# EasyEDA Pro project honglin-first_crt_smartphone-e4cb491d.epro, schematic CRT手机

## Sheets
1 SD、CPU、WIFI
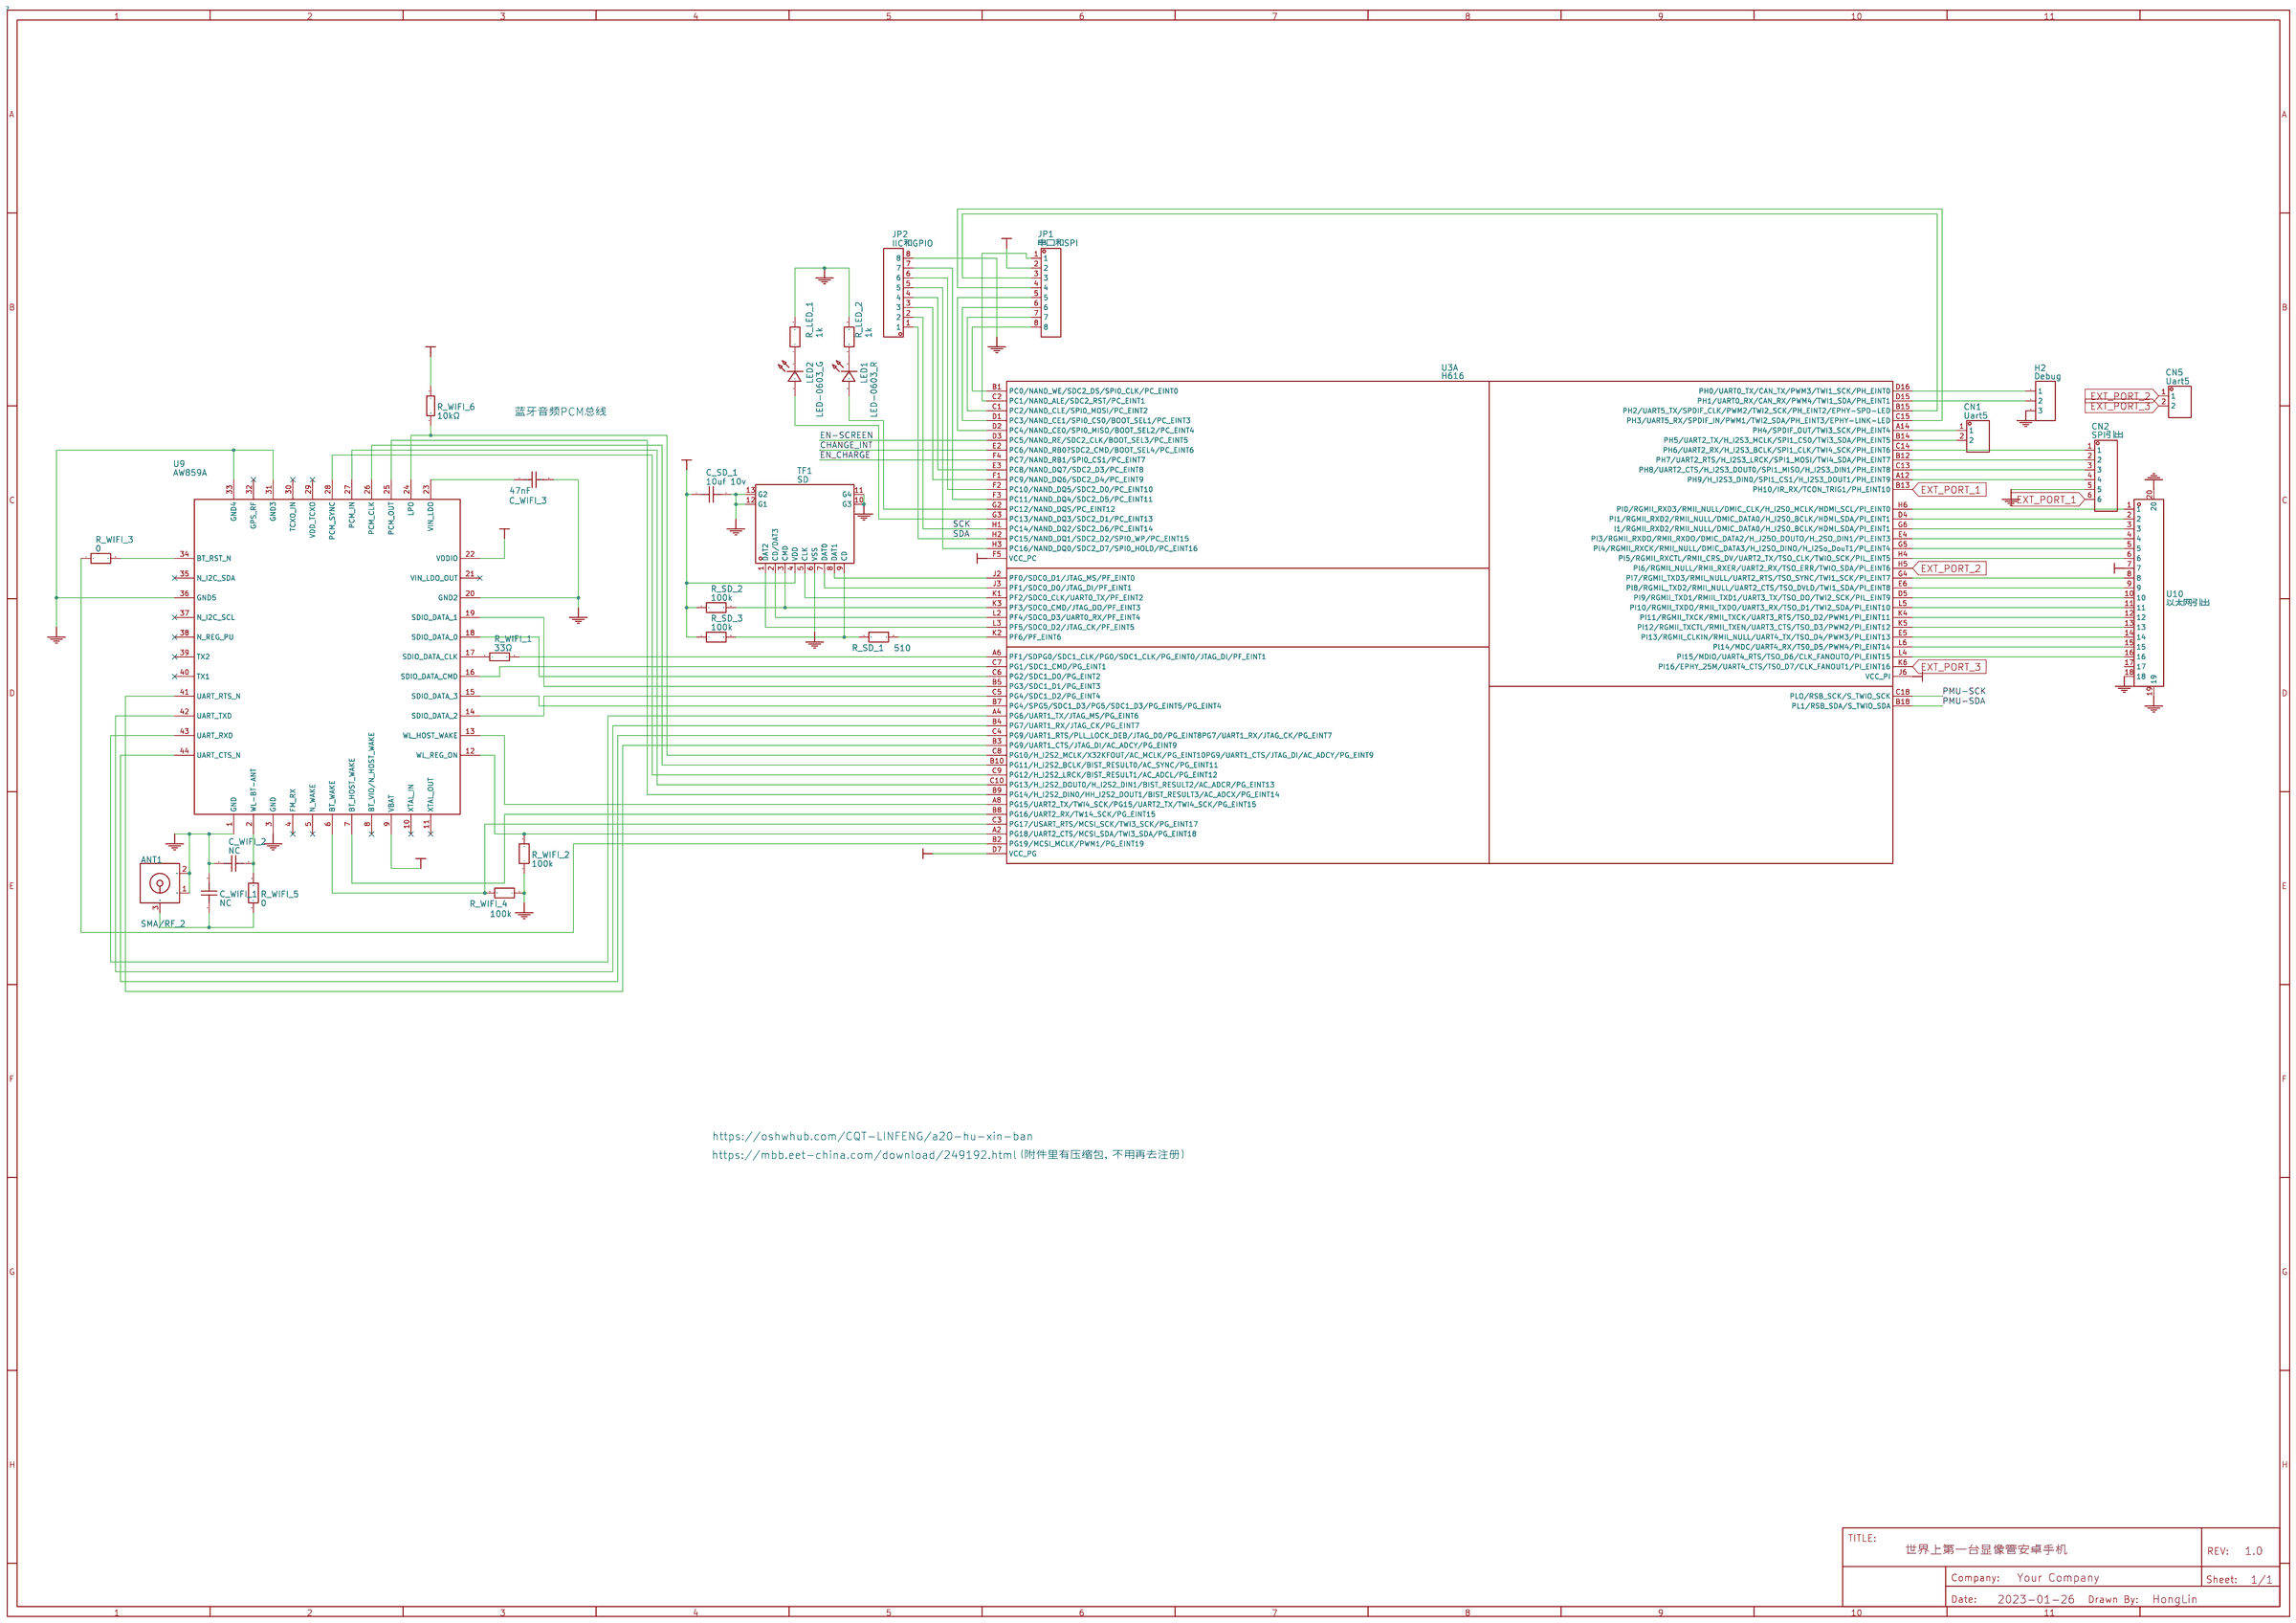
[diagram p0: SD、CPU、WIFI]
2 SCH-ATmega32a-IQK40A
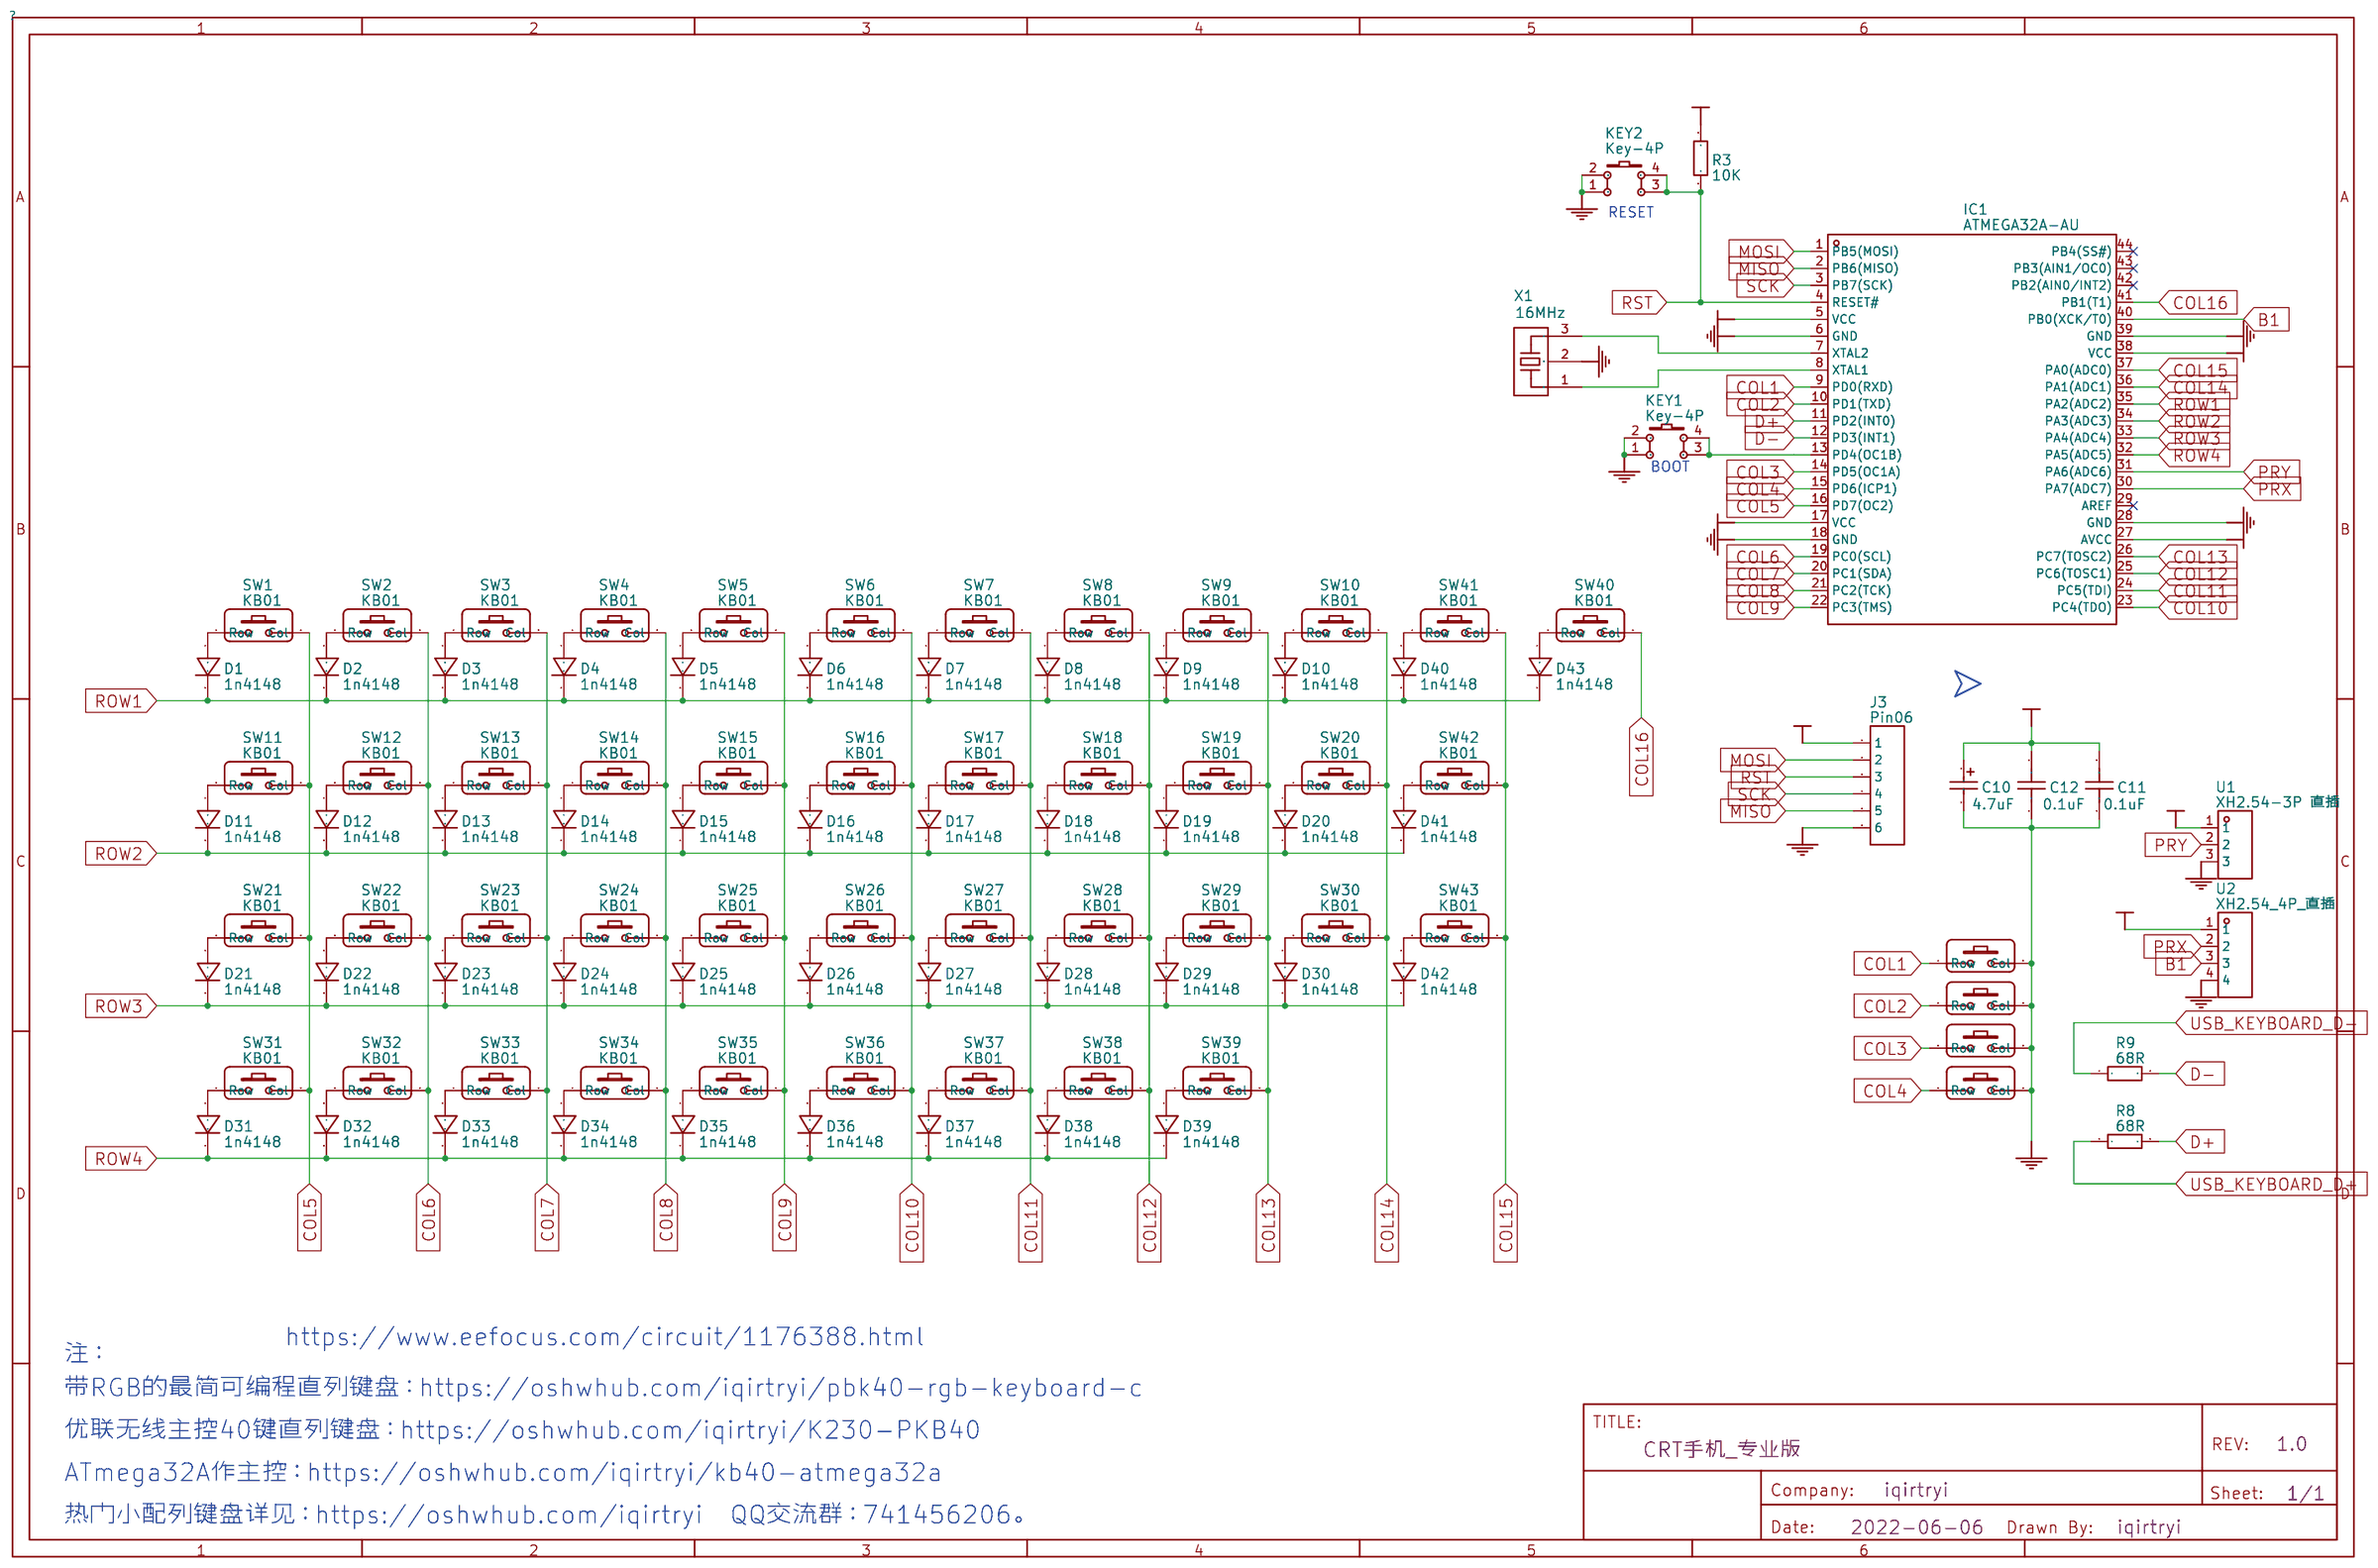
[diagram p1: SCH-ATmega32a-IQK40A]
3 电源管理
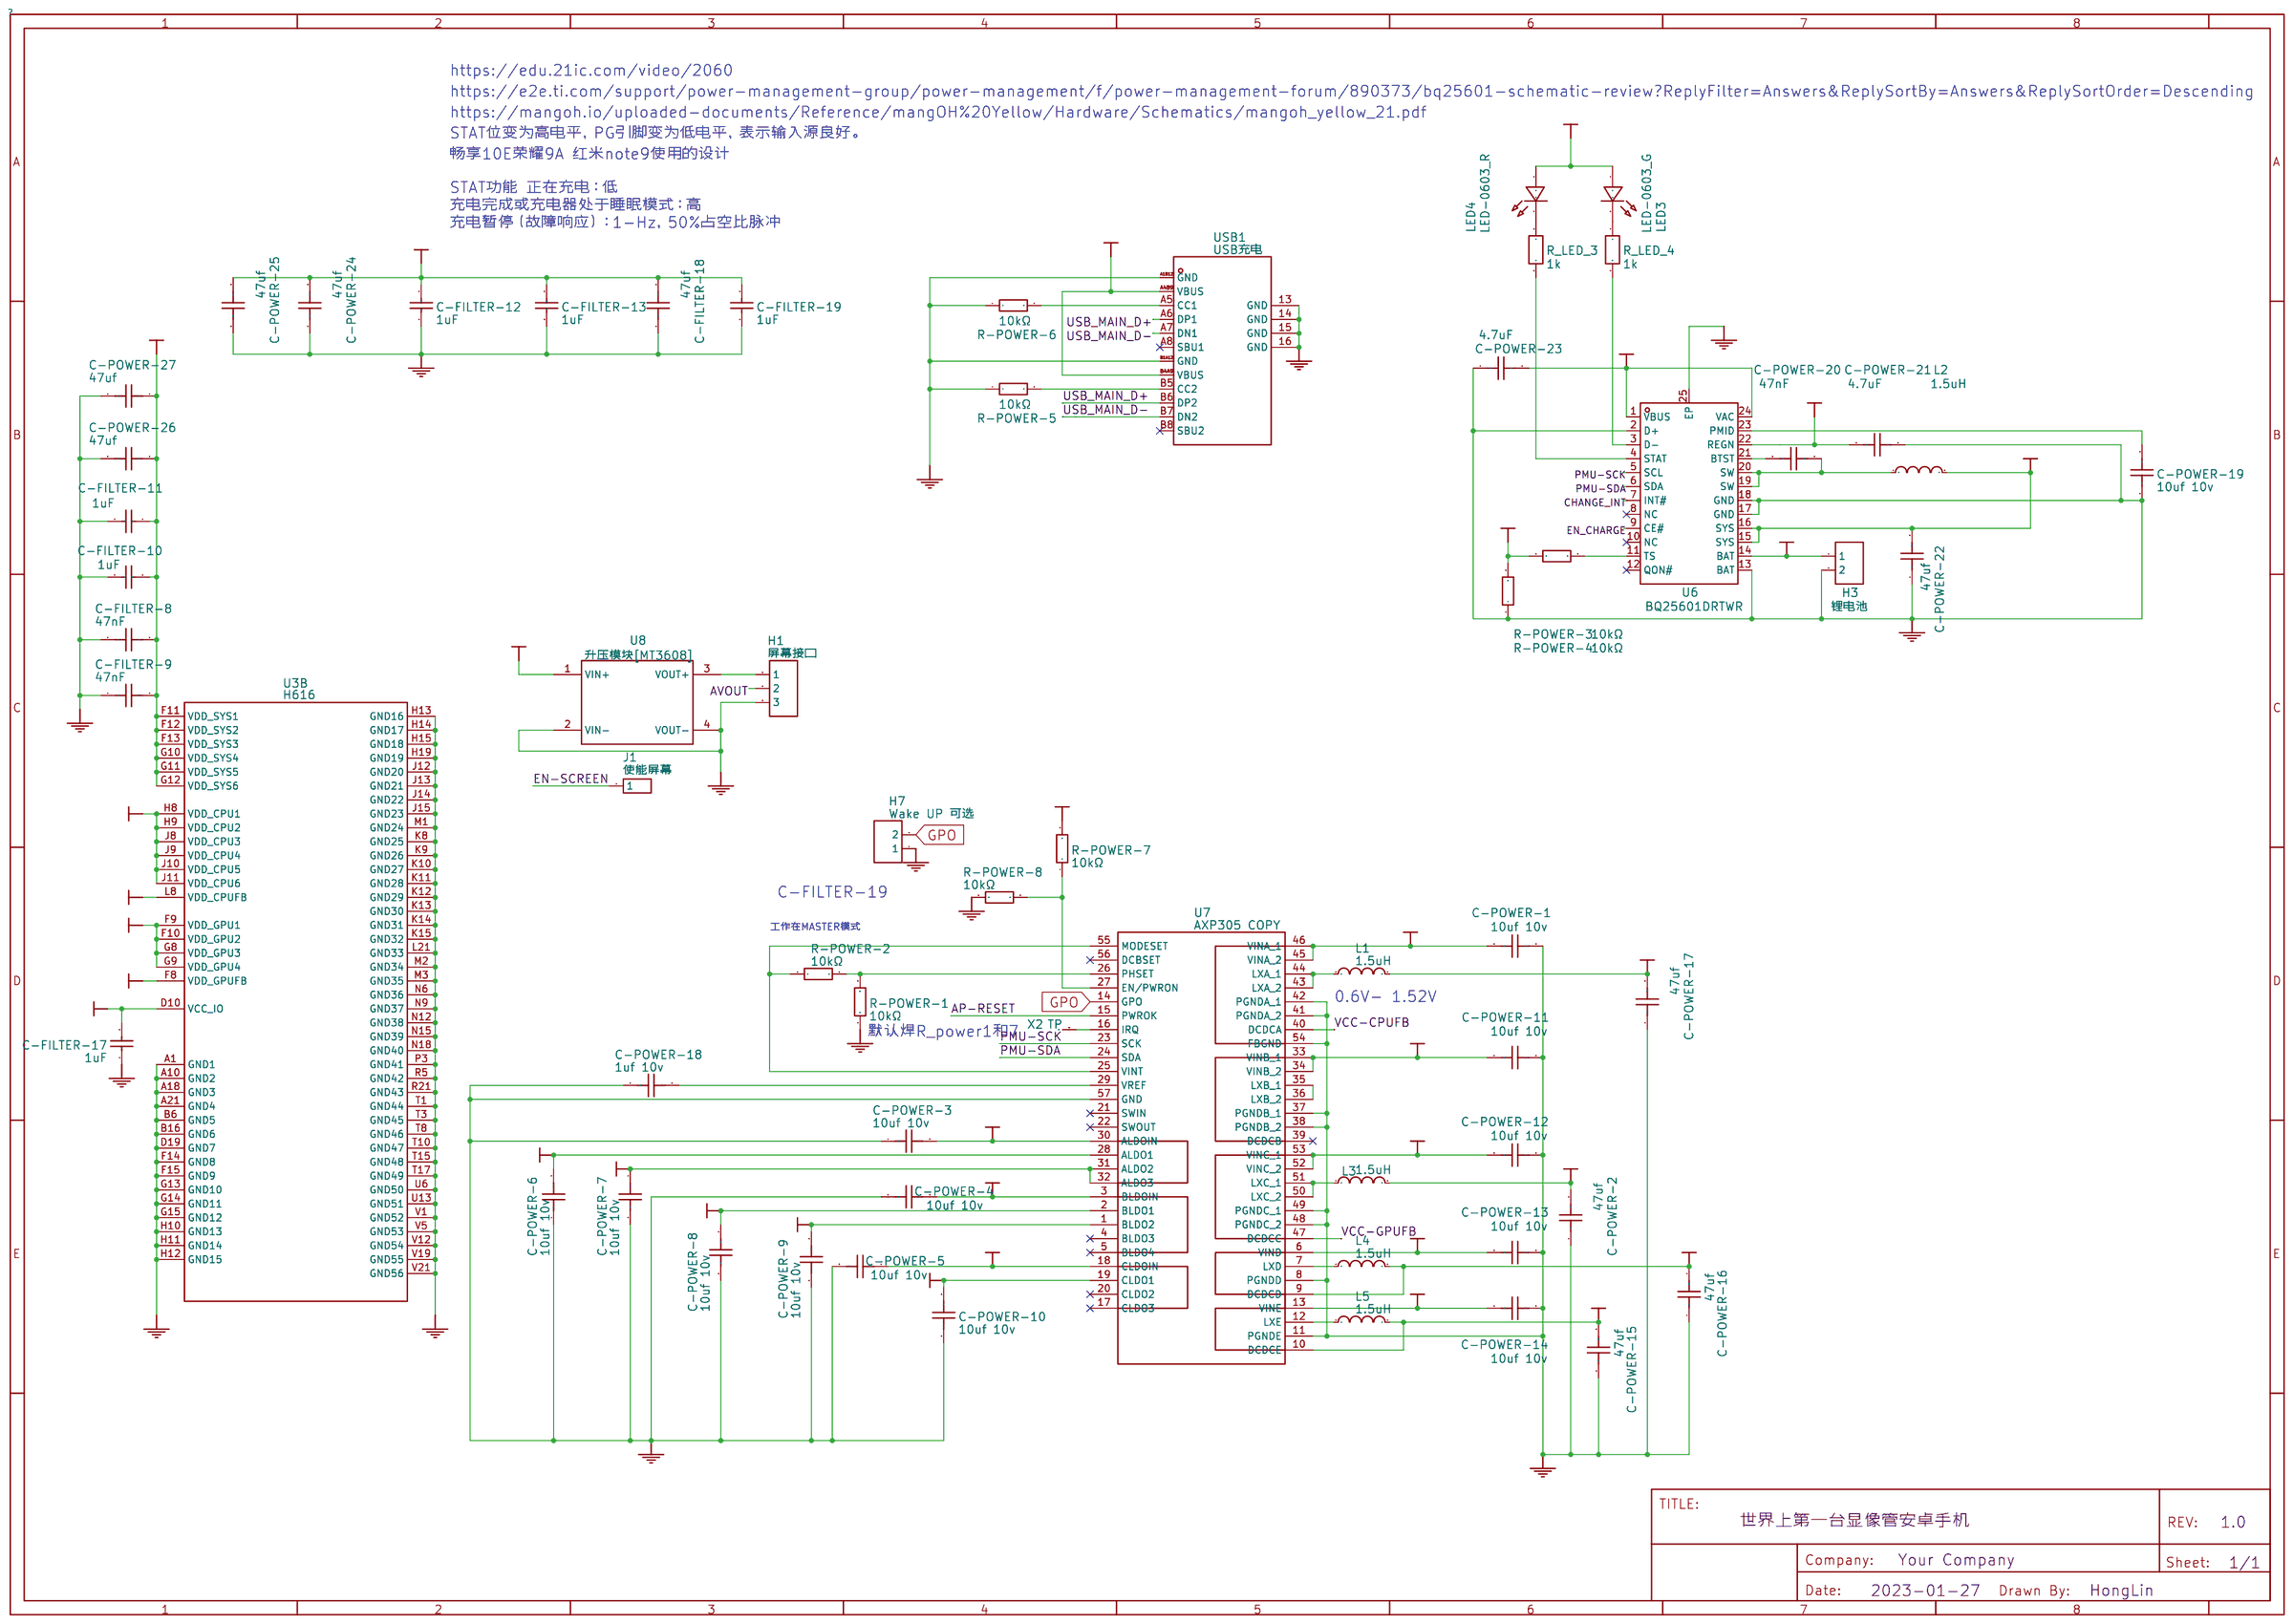
[diagram p2: 电源管理]
4 内存
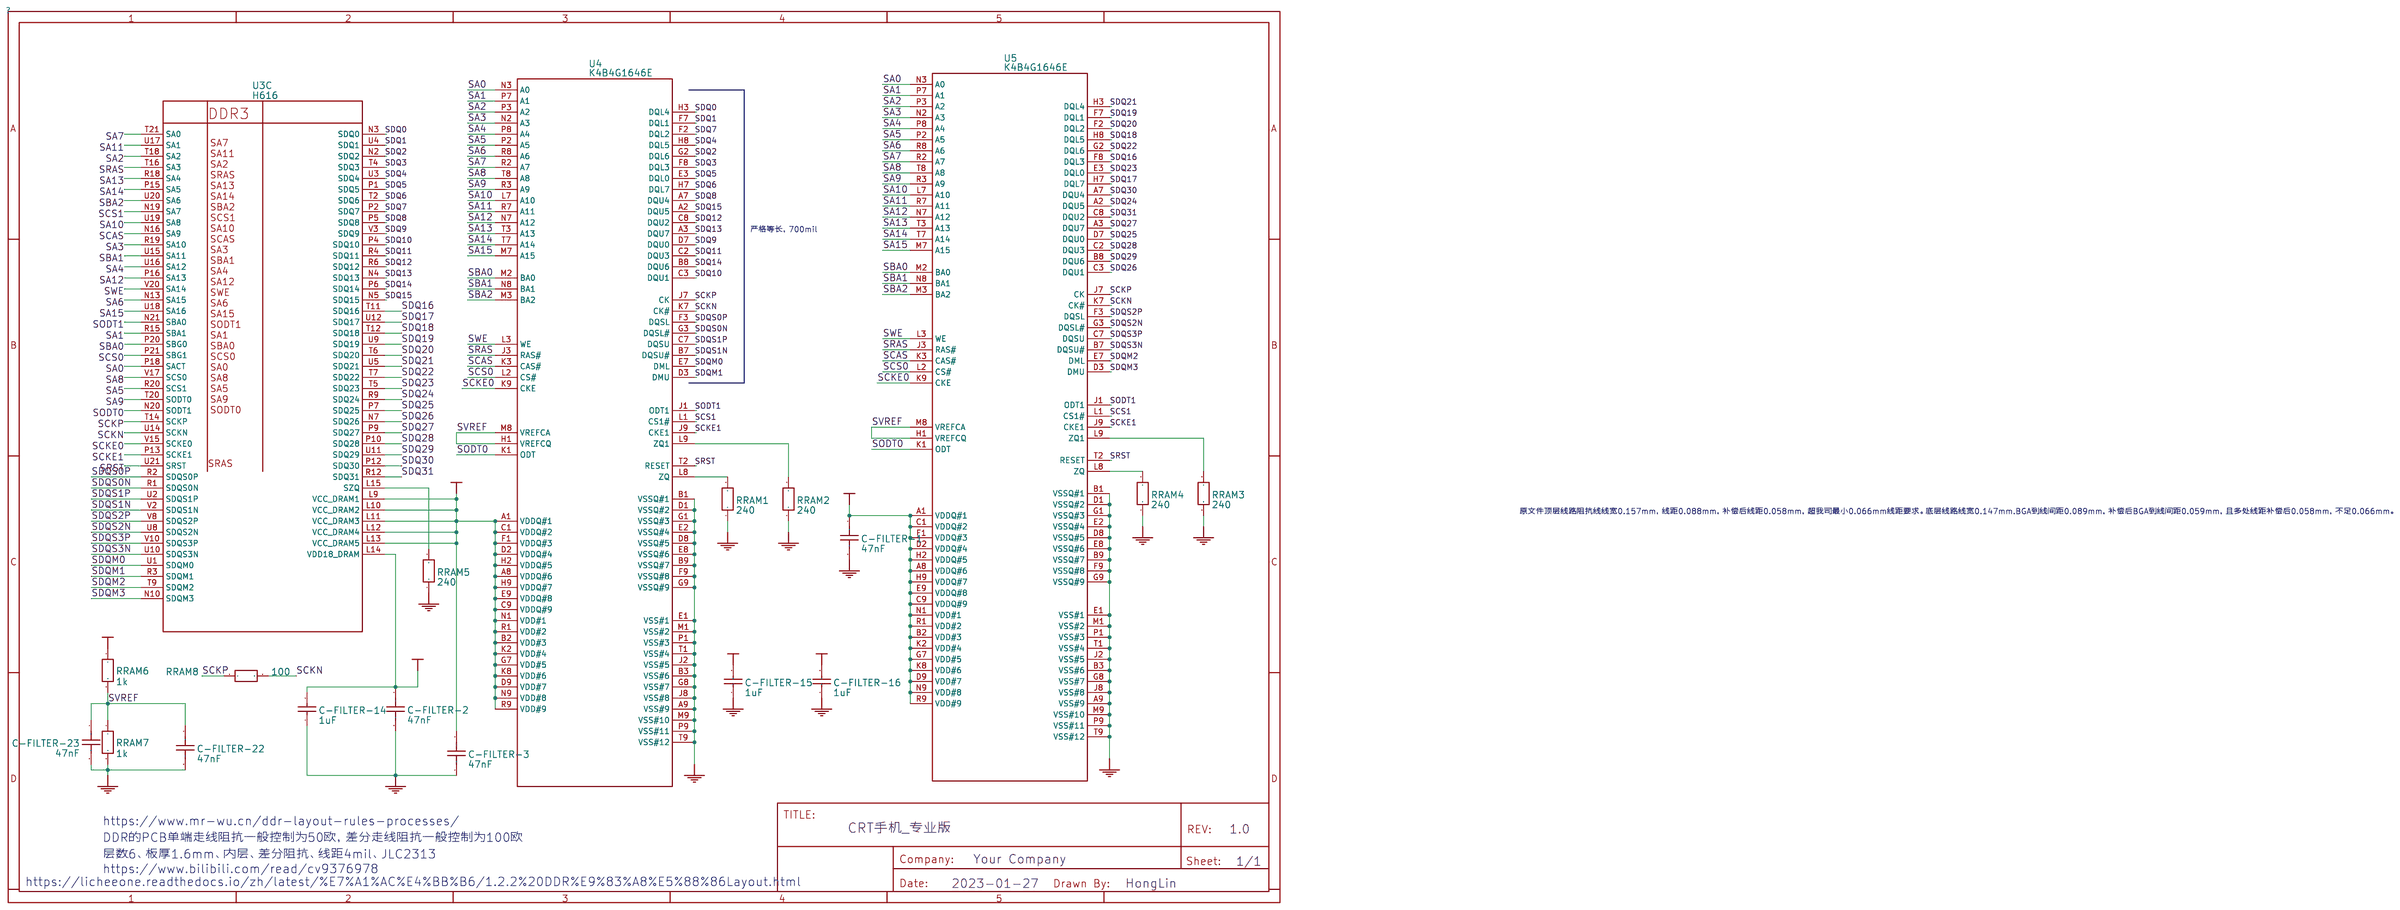
[diagram p3: 内存]
5 HDMI、USB
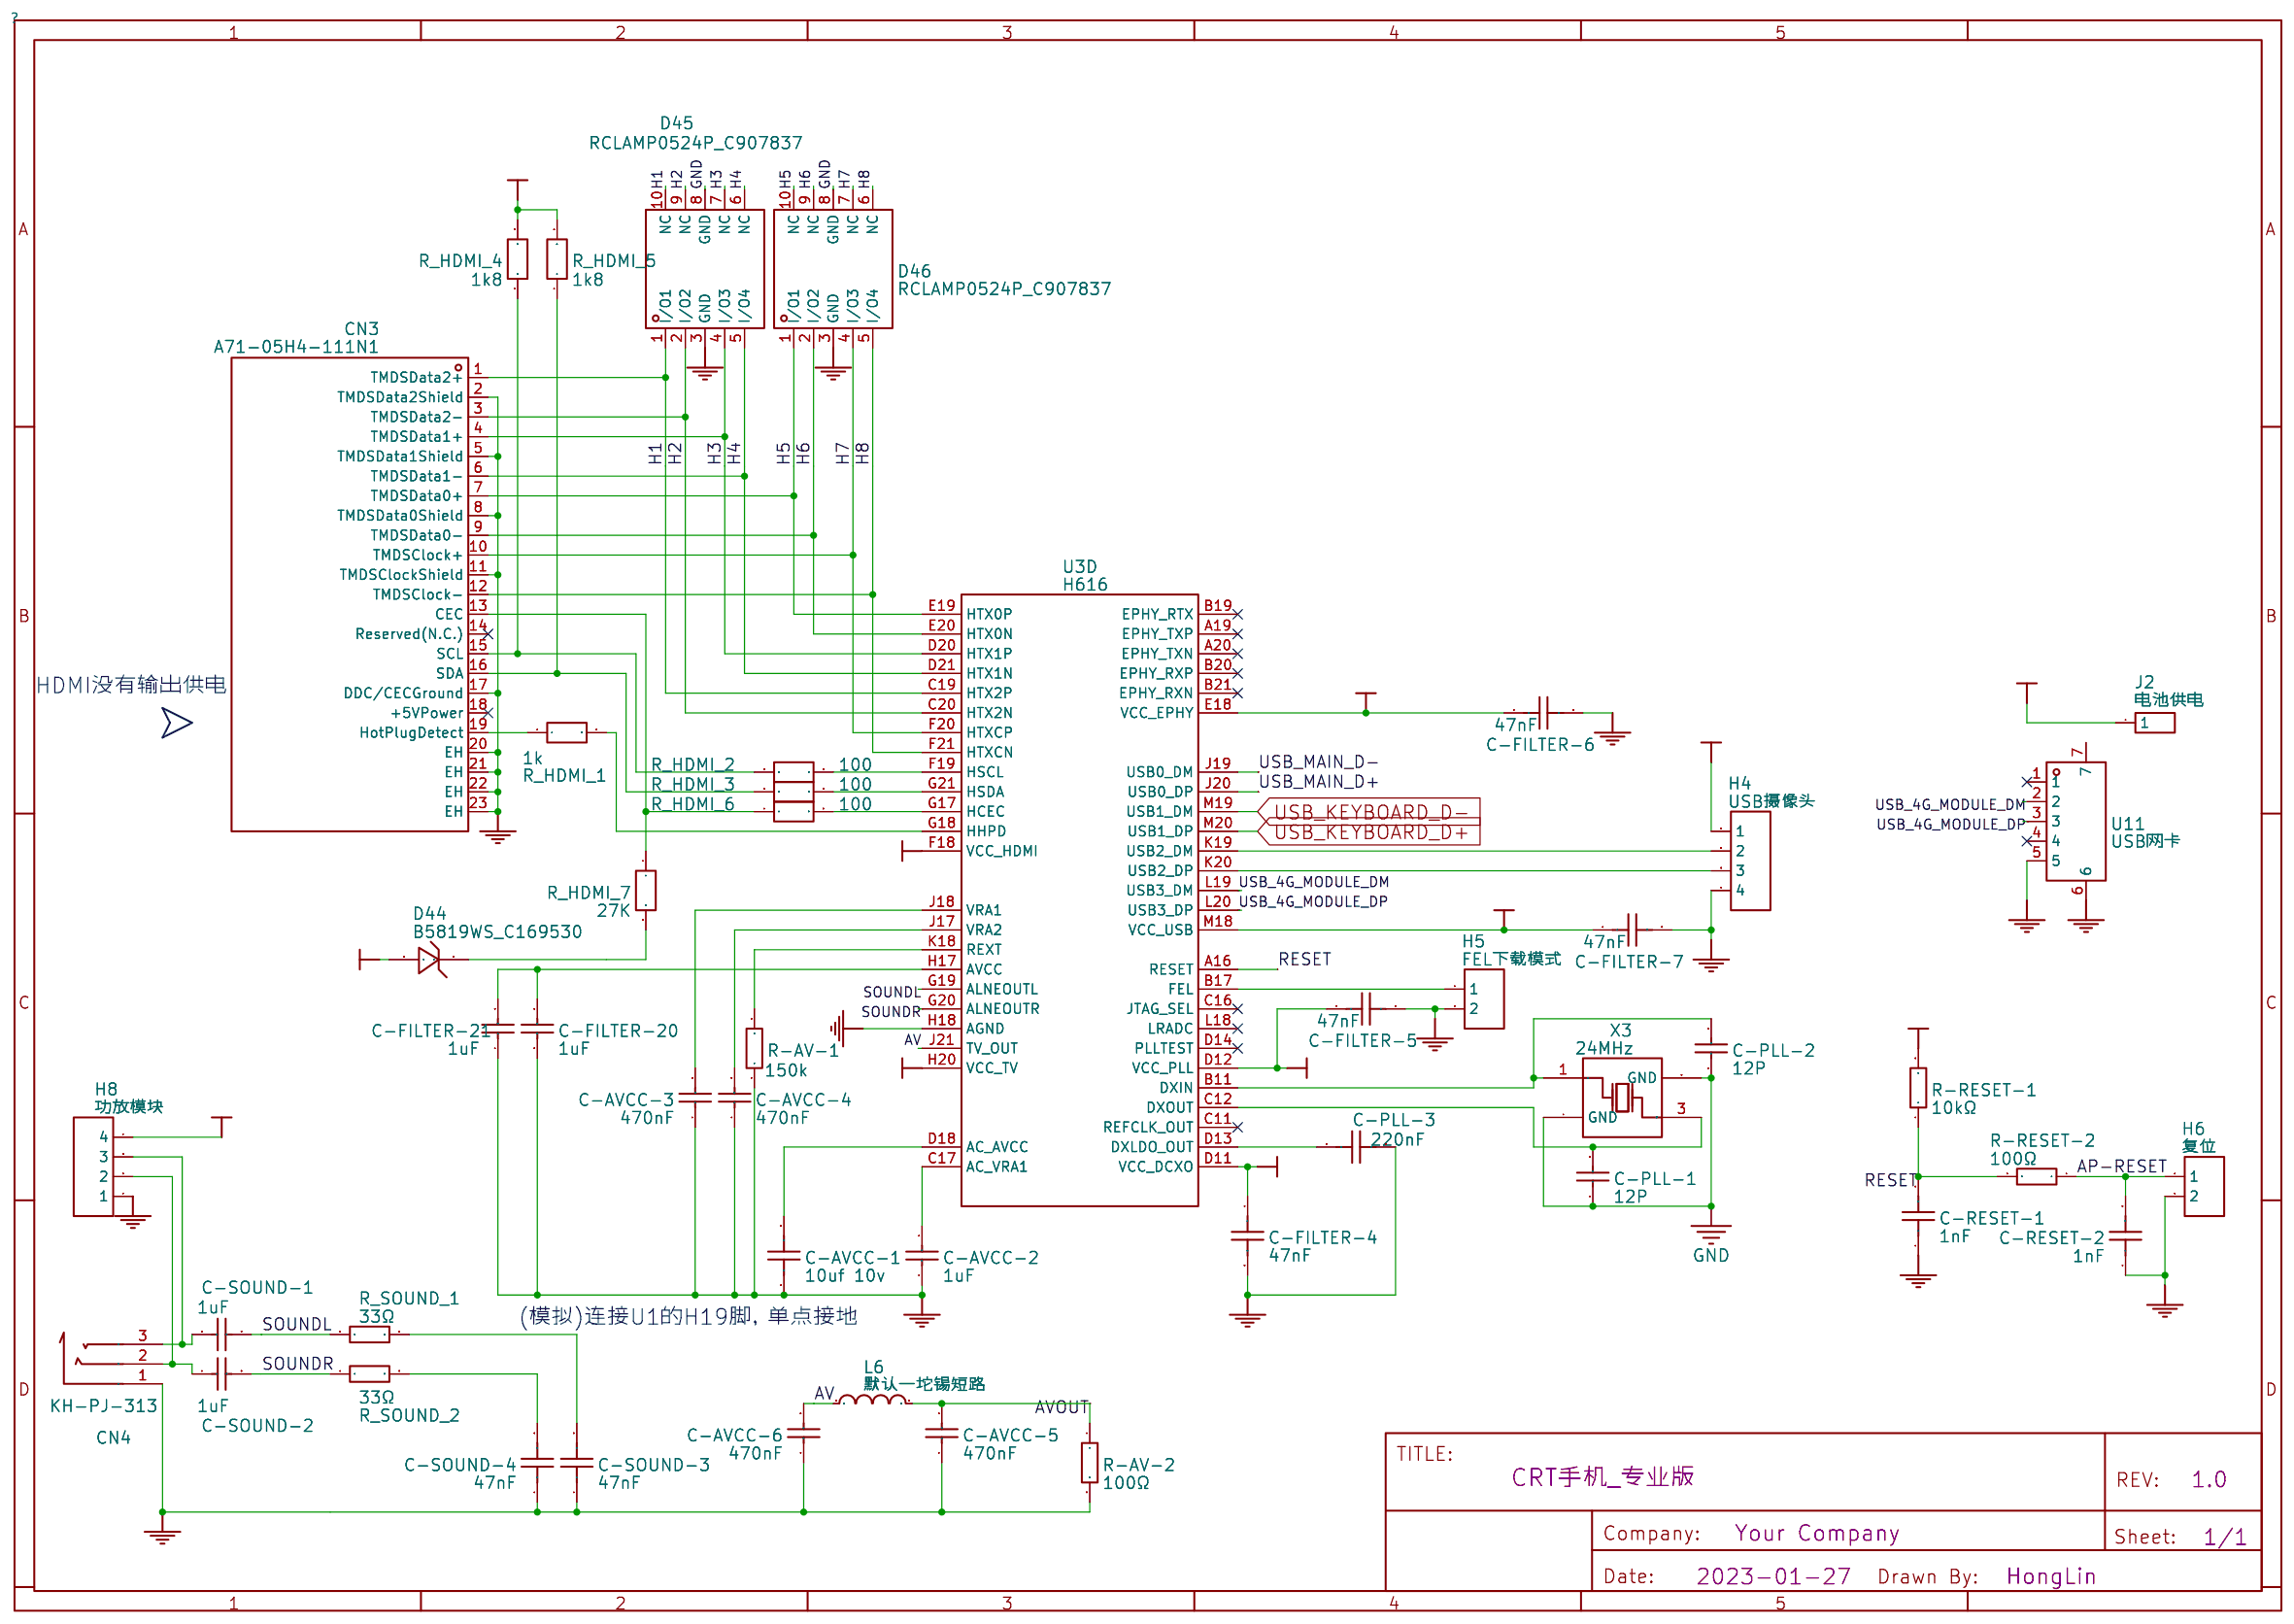
[diagram p4: HDMI、USB]

## Parts
sheet HDMI、USB
C-AVCC-1  10uf 10v  [C0603]
C-AVCC-2  1uF  [C0603]
C-AVCC-3  470nF  [C0603]
C-AVCC-4  470nF  [C0603]
C-AVCC-5  470nF  [C0603]
C-AVCC-6  470nF  [C0603]
C-FILTER-4  47nF  [C0603]
C-FILTER-5  47nF  [C0603]
C-FILTER-6  47nF  [C0603]
C-FILTER-7  47nF  [C0603]
C-FILTER-20  1uF  [C0603]
C-FILTER-21  1uF  [C0603]
C-PLL-1  12P  [C0603]
C-PLL-2  12P  [C0603]
C-PLL-3  220nF  [C0603]
C-RESET-1  1nF  [C0603]
C-RESET-2  1nF  [C0603]
C-SOUND-1  1uF  [C0603]
C-SOUND-2  1uF  [C0603]
C-SOUND-3  47nF  [C0603]
C-SOUND-4  47nF  [C0603]
CN3  A71-05H4-111N1  [HDMI-SMD_A71-05H4-111N1]
CN4  KH-PJ-313  [AUDIO-TH_KH-PJ-313]
D44  B5819WS_C169530  [SOD-323F_L2.0-W1.6-LS2.5-RD]
D45  RCLAMP0524P_C907837  [DFN2510-10_L2.5-W1.0-P0.50-BL]
D46  RCLAMP0524P_C907837  [DFN2510-10_L2.5-W1.0-P0.50-BL]
H4  USB摄像头  [HDR-F-2.54_1X4]
H5  FEL下载模式  [HDR-F-2.54_1X2]
H6  复位  [HDR-F-2.54_1X2]
H8  功放模块  [HDR-F-2.54_1X4]
J2  电池供电  [HDR-M-2.54_1X1]
L6  默认一坨锡短路  [L0603]
R-AV-1  150k  [R0603]
R-AV-2  100Ω  [R0603]
R-RESET-1  10kΩ  [R0603]
R-RESET-2  100Ω  [R0603]
R_HDMI_1  1k  [R0603]
R_HDMI_2  100  [R0603]
R_HDMI_3  100  [R0603]
R_HDMI_4  1k8  [R0603]
R_HDMI_5  1k8  [R0603]
R_HDMI_6  100  [R0603]
R_HDMI_7  27K  [R0603]
R_SOUND_1  33Ω  [R0603]
R_SOUND_2  33Ω  [R0603]
U11  USB网卡  [FPC-SMD_5P-P0.50_XUNPU_FPC-0.5AX-5PWBH20]
X3  24MHz  [OSC-SMD_4P-L3.2-W2.5-BL]
sheet SCH-ATmega32a-IQK40A
C10  4.7uF  [CAP-SMD_L3.2-W1.6-R-RD]
C11  0.1uF  [C0805]
C12  0.1uF  [C0805]
D1  1n4148  [LL-34_L3.5-W1.5-RD01]
D2  1n4148  [LL-34_L3.5-W1.5-RD01]
D3  1n4148  [LL-34_L3.5-W1.5-RD01]
D4  1n4148  [LL-34_L3.5-W1.5-RD01]
D5  1n4148  [LL-34_L3.5-W1.5-RD01]
D6  1n4148  [LL-34_L3.5-W1.5-RD01]
D7  1n4148  [LL-34_L3.5-W1.5-RD01]
D8  1n4148  [LL-34_L3.5-W1.5-RD01]
D9  1n4148  [LL-34_L3.5-W1.5-RD01]
D10  1n4148  [LL-34_L3.5-W1.5-RD01]
D11  1n4148  [LL-34_L3.5-W1.5-RD01]
D12  1n4148  [LL-34_L3.5-W1.5-RD01]
D13  1n4148  [LL-34_L3.5-W1.5-RD01]
D14  1n4148  [LL-34_L3.5-W1.5-RD01]
D15  1n4148  [LL-34_L3.5-W1.5-RD01]
D16  1n4148  [LL-34_L3.5-W1.5-RD01]
D17  1n4148  [LL-34_L3.5-W1.5-RD01]
D18  1n4148  [LL-34_L3.5-W1.5-RD01]
D19  1n4148  [LL-34_L3.5-W1.5-RD01]
D20  1n4148  [LL-34_L3.5-W1.5-RD01]
D21  1n4148  [LL-34_L3.5-W1.5-RD01]
D22  1n4148  [LL-34_L3.5-W1.5-RD01]
D23  1n4148  [LL-34_L3.5-W1.5-RD01]
D24  1n4148  [LL-34_L3.5-W1.5-RD01]
D25  1n4148  [LL-34_L3.5-W1.5-RD01]
D26  1n4148  [LL-34_L3.5-W1.5-RD01]
D27  1n4148  [LL-34_L3.5-W1.5-RD01]
D28  1n4148  [LL-34_L3.5-W1.5-RD01]
D29  1n4148  [LL-34_L3.5-W1.5-RD01]
D30  1n4148  [LL-34_L3.5-W1.5-RD01]
D31  1n4148  [LL-34_L3.5-W1.5-RD01]
D32  1n4148  [LL-34_L3.5-W1.5-RD01]
D33  1n4148  [LL-34_L3.5-W1.5-RD01]
D34  1n4148  [LL-34_L3.5-W1.5-RD01]
D35  1n4148  [LL-34_L3.5-W1.5-RD01]
D36  1n4148  [LL-34_L3.5-W1.5-RD01]
D37  1n4148  [LL-34_L3.5-W1.5-RD01]
D38  1n4148  [LL-34_L3.5-W1.5-RD01]
D39  1n4148  [LL-34_L3.5-W1.5-RD01]
D40  1n4148  [LL-34_L3.5-W1.5-RD01]
D41  1n4148  [LL-34_L3.5-W1.5-RD01]
D42  1n4148  [LL-34_L3.5-W1.5-RD01]
D43  1n4148  [LL-34_L3.5-W1.5-RD01]
IC1  ATMEGA32A-AU  [TQFP-44_L10.0-W10.0-P0.80-LS12.0-BL]
J3  Pin06  [PIN06]  (no BOM)
KEY1  Key-4P  [SW-SMD_4P-L5.1-W5.1-P3.70-LS6.5-TL-2]
KEY2  Key-4P  [SW-SMD_4P-L5.1-W5.1-P3.70-LS6.5-TL-2]
R3  10K  [R0805]
R8  68R  [R0805]
R9  68R  [R0805]
SW1  KB01  [6*6*5硅胶开关]
SW2  KB01  [6*6*5硅胶开关]
SW3  KB01  [6*6*5硅胶开关]
SW4  KB01  [6*6*5硅胶开关]
SW5  KB01  [6*6*5硅胶开关]
SW6  KB01  [6*6*5硅胶开关]
SW7  KB01  [6*6*5硅胶开关]
SW8  KB01  [6*6*5硅胶开关]
SW9  KB01  [6*6*5硅胶开关]
SW10  KB01  [6*6*5硅胶开关]
SW11  KB01  [6*6*5硅胶开关]
SW12  KB01  [6*6*5硅胶开关]
SW13  KB01  [6*6*5硅胶开关]
SW14  KB01  [6*6*5硅胶开关]
SW15  KB01  [6*6*5硅胶开关]
SW16  KB01  [6*6*5硅胶开关]
SW17  KB01  [6*6*5硅胶开关]
SW18  KB01  [6*6*5硅胶开关]
SW19  KB01  [6*6*5硅胶开关]
SW20  KB01  [6*6*5硅胶开关]
SW21  KB01  [6*6*5硅胶开关]
SW22  KB01  [6*6*5硅胶开关]
SW23  KB01  [6*6*5硅胶开关]
SW24  KB01  [6*6*5硅胶开关]
SW25  KB01  [6*6*5硅胶开关]
SW26  KB01  [6*6*5硅胶开关]
SW27  KB01  [6*6*5硅胶开关]
SW28  KB01  [6*6*5硅胶开关]
SW29  KB01  [6*6*5硅胶开关]
SW30  KB01  [6*6*5硅胶开关]
SW31  KB01  [6*6*5硅胶开关]
SW32  KB01  [6*6*5硅胶开关]
SW33  KB01  [6*6*5硅胶开关]
SW34  KB01  [6*6*5硅胶开关]
SW35  KB01  [6*6*5硅胶开关]
SW36  KB01  [6*6*5硅胶开关]
SW37  KB01  [6*6*5硅胶开关]
SW38  KB01  [6*6*5硅胶开关]
SW39  KB01  [6*6*5硅胶开关]
SW40  KB01  [6*6*5硅胶开关]
SW41  KB01  [6*6*5硅胶开关]
SW42  KB01  [6*6*5硅胶开关]
SW43  KB01  [6*6*5硅胶开关]
SW44  KB01  [6*6*5硅胶开关]
SW45  KB01  [6*6*5硅胶开关]
SW46  KB01  [6*6*5硅胶开关]
SW47  KB01  [6*6*5硅胶开关]
U1  XH2.54-3P 直插  [CONN-TH_XH2.54-3P]
U2  XH2.54_4P_直插  [CONN-TH_4P-P2.50-XH2.54-4P]
X1  16MHz  [OSC-SMD_3P-L3.2-W1.3-P1.2-L]
sheet SD、CPU、WIFI
ANT1  SMA/RF_2  [WIFI_ANT]
C_SD_1  10uf 10v  [C0603]
C_WIFI_1  NC  [C0603]
C_WIFI_2  NC  [C0603]
C_WIFI_3  47nF  [C0603]
CN1  Uart5  [CONN-TH_2P-P1.25_1.25T-2P-DP]
CN2  SPI引出  [CONN-TH_6P-P1.25_1.25T-6P-DP]
CN5  Uart5  [CONN-TH_2P-P1.25_1.25T-2P-DP]
H2  Debug  [HDR-F-2.54_1X3]
JP1  串口和SPI  [CONN-TH_8P-P1.25_1.25T-1-8A]
JP2  IIC和GPIO  [CONN-TH_8P-P1.25_1.25T-1-8A]
LED1  LED-0603_R  [LED0603_RED]
LED2  LED-0603_G  [LED0603_GREEN]
R_LED_1  1k  [R0603]
R_LED_2  1k  [R0603]
R_SD_1  510  [R0603]
R_SD_2  100k  [R0603]
R_SD_3  100k  [R0603]
R_WIFI_1  33Ω  [R0603]
R_WIFI_2  100k  [R0805]
R_WIFI_3  0  [R0805]
R_WIFI_4  100k  [R0805]
R_WIFI_5  0  [R0603]
R_WIFI_6  10kΩ  [R0603]
TF1  SD  [TF-SMD_TF-15-15]
U3  H616  [H616]  (sections 1,2,3,4)
U9  AW859A  [AW859A]
U10  以太网引出  [FPC-SMD_XUNPU_FPC-1.0AS-18PWBH25]
sheet 内存
C-FILTER-1  47nF  [C0603]
C-FILTER-2  47nF  [C0603]
C-FILTER-3  47nF  [C0603]
C-FILTER-14  1uF  [C0603]
C-FILTER-15  1uF  [C0603]
C-FILTER-16  1uF  [C0603]
C-FILTER-22  47nF  [C0603]
C-FILTER-23  47nF  [C0603]
RRAM1  240  [R0603]
RRAM2  240  [R0603]
RRAM3  240  [R0603]
RRAM4  240  [R0603]
RRAM5  240  [R0603]
RRAM6  1k  [R0603]
RRAM7  1k  [R0603]
RRAM8  100  [R0603]
U4  K4B4G1646E  [K4B4G1646E]
U5  K4B4G1646E  [K4B4G1646E]
sheet 电源管理
C-FILTER-8  47nF  [C0603]
C-FILTER-9  47nF  [C0603]
C-FILTER-10  1uF  [C0603]
C-FILTER-11  1uF  [C0603]
C-FILTER-12  1uF  [C0603]
C-FILTER-13  1uF  [C0603]
C-FILTER-17  1uF  [C0603]
C-FILTER-18  47uf  [C0603]
C-FILTER-19  1uF  [C0603]
C-POWER-1  10uf 10v  [C0603]
C-POWER-2  47uf  [C0603]
C-POWER-3  10uf 10v  [C0603]
C-POWER-4  10uf 10v  [C0603]
C-POWER-5  10uf 10v  [C0603]
C-POWER-6  10uf 10v  [C0603]
C-POWER-7  10uf 10v  [C0603]
C-POWER-8  10uf 10v  [C0603]
C-POWER-9  10uf 10v  [C0603]
C-POWER-10  10uf 10v  [C0603]
C-POWER-11  10uf 10v  [C0603]
C-POWER-12  10uf 10v  [C0603]
C-POWER-13  10uf 10v  [C0603]
C-POWER-14  10uf 10v  [C0603]
C-POWER-15  47uf  [C0603]
C-POWER-16  47uf  [C0603]
C-POWER-17  47uf  [C0603]
C-POWER-18  1uf 10v  [C0603]
C-POWER-19  10uf 10v  [C0603]
C-POWER-20  47nF  [C0603]
C-POWER-21  4.7uF  [C0603]
C-POWER-22  47uf  [C0603]
C-POWER-23  4.7uF  [C0603]
C-POWER-24  47uf  [C0603]
C-POWER-25  47uf  [C0603]
C-POWER-26  47uf  [C0603]
C-POWER-27  47uf  [C0603]
H1  屏幕接口  [HDR-F-2.54_1X3]
H3  锂电池  [HDR-F-2.54_1X2]
H7  Wake UP 可选  [HDR-F-2.54_1X2]
J1  使能屏幕  [HDR-M-2.54_1X1]
L1  1.5uH  [IND-SMD_L2.0-W1.6_SUMIDA_201610CDMCDDS]
L2  1.5uH  [IND-SMD_L2.0-W1.6_SUMIDA_201610CDMCDDS]
L3  1.5uH  [IND-SMD_L2.0-W1.6_SUMIDA_201610CDMCDDS]
L4  1.5uH  [IND-SMD_L2.0-W1.6_SUMIDA_201610CDMCDDS]
L5  1.5uH  [IND-SMD_L2.0-W1.6_SUMIDA_201610CDMCDDS]
LED3  LED-0603_G  [LED0603_GREEN]
LED4  LED-0603_R  [LED0603_RED]
R-POWER-1  10kΩ  [R0603]
R-POWER-2  10kΩ  [R0603]
R-POWER-3  10kΩ  [R0603]
R-POWER-4  10kΩ  [R0603]
R-POWER-5  10kΩ  [R0603]
R-POWER-6  10kΩ  [R0603]
R-POWER-7  10kΩ  [R0603]
R-POWER-8  10kΩ  [R0603]
R_LED_3  1k  [R0603]
R_LED_4  1k  [R0603]
U6  BQ25601DRTWR  [WQFN-24_L4.0-W4.0-P0.50-TL-EP2.7]
U7  AXP305 COPY  [AXP305]
U8  升压模块[MT3608]  [升压模块[MT3608]]
USB1  USB充电  [USB-C-SMD_TYPEC-304-BCP16]
X2  TP  [TP_SMD]

## Library data of the parts
C-AVCC-1 C-FILTER-18 C-POWER-1-C-POWER-19 C-POWER-22 C-POWER-24-C-POWER-27 = V106M0603X5R100NKT: Supplier Part: C5240380; Supplier: LCSC
C-AVCC-2 C-FILTER-10-C-FILTER-17 C-FILTER-19-C-FILTER-21 C-SOUND-1 C-SOUND-2 = CC0603KRX5R8BB105: Supplier: LCSC; Manufacturer: YAGEO(国巨); Supplier Part: C14664; JLCPCB Part Class: Extended Part
C-AVCC-3-C-AVCC-6 = 0603B474K500NT: Supplier: LCSC; Manufacturer: FH(风华); Supplier Part: C77572; JLCPCB Part Class: Extended Part
C-FILTER-1-C-FILTER-9 C-FILTER-22 C-FILTER-23 C-POWER-20 C-SOUND-3 C-SOUND-4 C_WIFI_3 = 0603B473K500NT: Supplier: LCSC; Supplier Part: C285123; Manufacturer: FH(风华); JLCPCB Part Class: Extended Part
C-PLL-1 C-PLL-2 = CL10C120JB8NNNC: Supplier: LCSC; Manufacturer: SAMSUNG(三星); Supplier Part: C38523; JLCPCB Part Class: Basic Part
C-PLL-3 = CL10A224KA8NNWC: Supplier: LCSC; Supplier Part: C730439; Manufacturer: SAMSUNG(三星); JLCPCB Part Class: Extended Part
C-RESET-1 C-RESET-2 = GRM188R71H102KA01D: Supplier: LCSC; Manufacturer: muRata(村田); Supplier Part: C71653; JLCPCB Part Class: Extended Part
CN3 = A71-05H4-111N1: Supplier: LCSC; Supplier Part: C2682170; Manufacturer: XKB Connectivity(中国星坤); JLCPCB Part Class: Extended Part
CN4 = KH-PJ-313: Supplier: LCSC; Supplier Part: C5123143; Manufacturer: kinghelm(金航标); JLCPCB Part Class: Extended Part
D44 = B5819WS: Supplier: LCSC; Supplier Part: C169530; Manufacturer: 晶导微电子; JLCPCB Part Class: Extended Part
D45 D46 = RCLAMP0524P: Supplier: LCSC; Supplier Part: C907837; Manufacturer: TECH PUBLIC(台舟); JLCPCB Part Class: Extended Part
H4 = USB摄像头: Supplier Part: C225501; Supplier: LCSC
H5 = FEL下载模式: Supplier Part: C49661; Supplier: LCSC
H6 = 复位: Supplier Part: C49661; Supplier: LCSC
H8 = 功放模块: Supplier Part: C225501; Supplier: LCSC
J2 = 电池供电: Supplier Part: C81276; Supplier: LCSC
L6 = 默认一坨锡短路
R-AV-1 = RC0603JR-07150KL: Supplier: LCSC; Manufacturer: YAGEO(国巨); Supplier Part: C115417; JLCPCB Part Class: Extended Part; Resistance: 150kΩ
R-AV-2 R-RESET-2 = 100Ω: Supplier: LCSC; Resistance: 100; Supplier Part: C193336; JLCPCB Part Class: Extended Part
R-POWER-1-R-POWER-8 R-RESET-1 R_WIFI_6 = ERJ3GEYJ103V: Supplier: LCSC; Manufacturer: PANASONIC(松下); Resistance: 10K; Supplier Part: C169849; JLCPCB Part Class: Extended Part
R_HDMI_1 R_LED_1-R_LED_4 RRAM6 RRAM7 = 1k: Supplier Part: C21190; Supplier: LCSC
R_HDMI_2 R_HDMI_3 R_HDMI_6 RRAM8 = 100: Supplier Part: C25076; Supplier: LCSC
R_HDMI_4 R_HDMI_5 = 1k8: Supplier Part: C25076; Supplier: LCSC
R_HDMI_7 = 27K: Supplier Part: C25771; Supplier: LCSC
R_SOUND_1 R_SOUND_2 R_WIFI_1 = RS-03K33R0FT: Supplier: LCSC; Manufacturer: FH(风华); Supplier Part: C125766; Resistance: 33; JLCPCB Part Class: Extended Part
U11 = FPC-0.5AX-5PWBH20: Supplier: LCSC; Supplier Part: C3446078; Manufacturer: XUNPU(讯普); link: https://atta.szlcsc.com/upload/public/pdf/source/20220630/2E5106BC55345DA1B681DA917D4BB3B6.pdf
X3 = X1E000021012700: Supplier: LCSC; Manufacturer: EPSON(爱普生); Supplier Part: C89577; JLCPCB Part Class: Extended Part
C10 = TAJA106K010RNJ: Supplier: LCSC; Manufacturer: AVX; Supplier Part: C7177; JLCPCB Part Class: Extend
C11 C12 = 0.1uF: Supplier: LCSC; Supplier Part: C302043
D1-D43 = MCL4148-TR3: Supplier: LCSC; Manufacturer: VISHAY; Supplier Part: C146440; JLCPCB Part Class: Extended Part
IC1 = ATMEGA32A-AU: Supplier: LCSC; Manufacturer: MICROCHIP; Supplier Part: C5659; JLCPCB Part Class: Extended Part
J3 = Pin06: Supplier Part: C190819; Supplier: LCSC
KEY1 KEY2 = K2-1103DP-M4SW-04: Supplier Part: C1121873; Supplier: LCSC; Manufacturer: XKB Connectivity
R3 R8 R9 = QR0805F1KP05: Supplier: LCSC; Supplier Part: C176197; Manufacturer: Ever Ohms Tech
SW1-SW47 = 00
U1 = XH2.54-3P 直插: Supplier: LCSC; Supplier Part: C9900000727; Manufacturer: null; JLCPCB Part Class: Extended Part
U2 = XH2.54_4P_直插: Supplier: LCSC; Supplier Part: C9900008616; Manufacturer: null; JLCPCB Part Class: Extended Part
X1 = CSTCE16M0V53C-R0: Supplier: LCSC; Manufacturer: MuRata; Supplier Part: C91584
ANT1 = SMA/RF_2
C_SD_1 = 10u: Supplier Part: C5240380; Supplier: LCSC
C_WIFI_1 C_WIFI_2 = NC
CN1 CN5 = 1.25T-2P-DP: Supplier: LCSC; Manufacturer: 韩国韩荣; Supplier Part: C145940; JLCPCB Part Class: Extended Part
CN2 = 1.25T-6P-DP: Supplier: LCSC; Manufacturer: 韩国韩荣; Supplier Part: C145933; JLCPCB Part Class: Extended Part
H2 = Debug: Supplier Part: C146690; Supplier: LCSC
JP1 JP2 = 1.25T-8A: Supplier: LCSC; Manufacturer: BOOMELE(博穆精密); Supplier Part: C10825; JLCPCB Part Class: Extended Part
LED1 LED4 = 19-217/R6C-AL1M2VY/3T: Manufacturer: EVERLIGHT(台湾亿光); Supplier Part: C72044; Supplier: LCSC
LED2 LED3 = 19-217/GHC-YR1S2/3T: Manufacturer: EVERLIGHT(台湾亿光); Supplier Part: C72043; Supplier: LCSC
R_SD_1 = 510: Supplier Part: C2682170; Supplier: LCSC
R_SD_2 R_SD_3 = 100k: Supplier: LCSC
R_WIFI_2 R_WIFI_4 = 100k
R_WIFI_3 R_WIFI_5 = 0
TF1 = SD: Supplier: LCSC; Supplier Part: C9900023771; Manufacturer: null; JLCPCB Part Class: Extended Part
U3 = H616: Supplier: 全志
U9 = AW859A
U10 = FPC-1.0AS-18PWBH25: Supplier: LCSC; Supplier Part: C3446124; Manufacturer: XUNPU(讯普); link: https://atta.szlcsc.com/upload/public/pdf/source/20220630/3C4024B574DBDB5827C0591DA3A1D39E.pdf; JLCPCB Part Class: Extended Part
RRAM1-RRAM5 = 240
U4 U5 = K4B4G1646E: Manufacturer: SAMSUNG; Supplier: SAMSUNG; Supplier Part: C500275
C-POWER-21 C-POWER-23 = GRM188B30J475KE18D: Supplier: LCSC; Manufacturer: muRata(村田); Supplier Part: C85990; JLCPCB Part Class: Extended Part
H1 = 屏幕接口: Supplier Part: C146690; Supplier: LCSC
H3 = 锂电池: Supplier Part: C49661; Supplier: LCSC
H7 = Wake UP 可选: Supplier Part: C49661; Supplier: LCSC
J1 = 使能屏幕: Supplier Part: C81276; Supplier: LCSC
L1-L5 = HPI201612P-1R5M: Supplier: LCSC; Supplier Part: C326047; Manufacturer: 3L COILS(三礼); JLCPCB Part Class: Extended Part
U6 = BQ25601DRTWR: Supplier: LCSC; Supplier Part: C2859691; Manufacturer: TI(德州仪器); link: https://atta.szlcsc.comnull; JLCPCB Part Class: Extended Part
U7 = AXP305 COPY
U8 = 升压模块[MT3608]: Supplier: 优信电子
USB1 = TYPEC-304-BCP16: Supplier: LCSC; Supplier Part: C720629; Manufacturer: XUNPU(讯普); JLCPCB Part Class: Extended Part
X2 = TP

## Nets
GND: ANT1.1(CENTER) ANT1.2(SHIELD1) C10.2 C11.1 C12.1 C-AVCC-1.1 C-AVCC-2.1 C-AVCC-3.1 C-AVCC-4.1 C-AVCC-5.1 C-AVCC-6.1 C-FILTER-1.2 C-FILTER-2.2 C-FILTER-3.2 C-FILTER-4.2 C-FILTER-5.2 C-FILTER-6.2 C-FILTER-7.2 C-FILTER-8.1 C-FILTER-9.1 C-FILTER-10.2 C-FILTER-11.2 C-FILTER-12.1 C-FILTER-13.1 C-FILTER-14.1 C-FILTER-15.1 C-FILTER-16.1 C-FILTER-17.1 C-FILTER-18.1 C-FILTER-19.1 C-FILTER-20.2 C-FILTER-21.1 C-FILTER-22.2 C-FILTER-23.2 C-PLL-1.1 C-PLL-2.2 C-PLL-3.2 C-POWER-1.2 C-POWER-2.1 C-POWER-3.1 C-POWER-4.2 C-POWER-5.2 C-POWER-6.1 C-POWER-7.2 C-POWER-8.2 C-POWER-9.2 C-POWER-10.2 C-POWER-11.2 C-POWER-12.2 C-POWER-13.2 C-POWER-14.2 C-POWER-15.1 C-POWER-16.1 C-POWER-17.1 C-POWER-18.1 C-POWER-19.1 C-POWER-21.2 C-POWER-22.1 C-POWER-23.1 C-POWER-24.1 C-POWER-25.1 C-POWER-26.2 C-POWER-27.2 C-RESET-1.1 C-RESET-2.1 C-SOUND-3.1 C-SOUND-4.1 C_SD_1.2 C_WIFI_1.2 C_WIFI_2.1 C_WIFI_3.2 CN2.5 CN3.2(TMDSData2Shield) CN3.5(TMDSData1Shield) CN3.8(TMDSData0Shield) CN3.11(TMDSClockShield) CN3.17(DDC/CECGround) CN3.20(EH) CN3.21(EH) CN3.22(EH) CN3.23(EH) CN4.1 D45.3(GND) D45.8(GND) D46.3(GND) D46.8(GND) H1.3 H2.3 H3.2 H4.4 H5.2 H6.2 H7.1 H8.1 IC1.6(GND) IC1.18(GND) IC1.28(GND) IC1.39(GND) J3.6 JP2.8 KEY1.1 KEY1.2 KEY2.1 KEY2.2 R-AV-1.1 R-AV-2.2 R-POWER-1.1 R-POWER-4.1 R-POWER-5.1 R-POWER-6.1 R-POWER-8.2 R_LED_1.2 R_LED_2.2 R_WIFI_2.1 R_WIFI_4.1 RRAM1.1 RRAM2.1 RRAM3.1 RRAM4.1 RRAM5.1 RRAM7.2 SW44.2(Col) SW45.2(Col) SW46.2(Col) SW47.2(Col) TF1.6(VSS) TF1.10(G3) TF1.11(G4) TF1.12(G1) TF1.13(G2) U1.3 U2.4 U3.A1(GND1) U3.A10(GND2) U3.A18(GND3) U3.A21(GND4) U3.B6(GND5) U3.B16(GND6) U3.D19(GND7) U3.F14(GND8) U3.F15(GND9) U3.G13(GND10) U3.G14(GND11) U3.G15(GND12) U3.H10(GND13) U3.H11(GND14) U3.H12(GND15) U3.H13(GND16) U3.H14(GND17) U3.H15(GND18) U3.H18(AGND) U3.H19(GND19) U3.J12(GND20) U3.J13(GND21) U3.J14(GND22) U3.J15(GND23) U3.K8(GND25) U3.K9(GND26) U3.K10(GND27) U3.K11(GND28) U3.K12(GND29) U3.K13(GND30) U3.K14(GND31) U3.K15(GND32) U3.L21(GND33) U3.M1(GND24) U3.M2(GND34) U3.M3(GND35) U3.N6(GND36) U3.N9(GND37) U3.N12(GND38) U3.N15(GND39) U3.N18(GND40) U3.P3(GND41) U3.R5(GND42) U3.R21(GND43) U3.T1(GND44) U3.T3(GND45) U3.T8(GND46) U3.T10(GND47) U3.T15(GND48) U3.T17(GND49) U3.U6(GND50) U3.U13(GND51) U3.V1(GND52) U3.V5(GND53) U3.V12(GND54) U3.V19(GND55) U3.V21(GND56) U4.A9(VSS#9) U4.B1(VSSQ#1) U4.B3(VSS#6) U4.B9(VSSQ#7) U4.D1(VSSQ#2) U4.D8(VSSQ#5) U4.E1(VSS#1) U4.E2(VSSQ#4) U4.E8(VSSQ#6) U4.F9(VSSQ#8) U4.G1(VSSQ#3) U4.G8(VSS#7) U4.G9(VSSQ#9) U4.J2(VSS#5) U4.J8(VSS#8) U4.M1(VSS#2) U4.M9(VSS#10) U4.P1(VSS#3) U4.P9(VSS#11) U4.T1(VSS#4) U4.T9(VSS#12) U5.A9(VSS#9) U5.B1(VSSQ#1) U5.B3(VSS#6) U5.B9(VSSQ#7) U5.D1(VSSQ#2) U5.D8(VSSQ#5) U5.E1(VSS#1) U5.E2(VSSQ#4) U5.E8(VSSQ#6) U5.F9(VSSQ#8) U5.G1(VSSQ#3) U5.G8(VSS#7) U5.G9(VSSQ#9) U5.J2(VSS#5) U5.J8(VSS#8) U5.M1(VSS#2) U5.M9(VSS#10) U5.P1(VSS#3) U5.P9(VSS#11) U5.T1(VSS#4) U5.T9(VSS#12) U6.2(D+) U6.13(BAT) U6.17(GND) U6.18(GND) U6.25(EP) U7.8(PGNDD) U7.11(PGNDE) U7.37(PGNDB_1) U7.38(PGNDB_2) U7.41(PGNDA_2) U7.42(PGNDA_1) U7.48(PGNDC_2) U7.49(PGNDC_1) U7.54(FBGND) U7.57(GND) U8.2(VIN-) U8.4(VOUT-) U9.1(GND) U9.3(GND) U9.20(GND2) U9.31(GND3) U9.33(GND4) U9.36(GND5) U10.18 U10.19 U10.20 U11.5 U11.6 USB1.13(GND) USB1.14(GND) USB1.15(GND) USB1.16(GND) USB1.A1B12(GND) USB1.B1A12(GND) X1.2 X3.2(GND) X3.4(GND)
VBAT: H3.1 U6.14(BAT)
VCC: C10.1 C11.2 C12.2 IC1.5(VCC) IC1.17(VCC) IC1.27(AVCC) IC1.38(VCC) J3.1 R3.2
VCC25-DRAM: C-POWER-10.1 U7.19(CLDO1)
VCC-5V: C-POWER-1.1 C-POWER-3.2 C-POWER-4.1 C-POWER-5.1 C-POWER-11.1 C-POWER-12.1 C-POWER-13.1 C-POWER-14.1 C-POWER-22.2 H8.4 J2.1 JP1.2 L2.2 LED3.1 LED4.1 R-POWER-7.2 U6.15(SYS) U6.16(SYS) U7.3(BLDOIN) U7.6(VIND) U7.13(VINE) U7.18(CLDOIN) U7.30(ALDOIN) U7.33(VINB_1) U7.34(VINB_2) U7.45(VINA_2) U7.46(VINA_1) U7.52(VINC_2) U7.53(VINC_1) U8.1(VIN+)
VCC-CPU: C-FILTER-12.2 C-FILTER-13.2 C-FILTER-18.2 C-FILTER-19.2 C-POWER-17.2 C-POWER-24.2 C-POWER-25.2 L1.2 U3.H8(VDD_CPU1) U3.H9(VDD_CPU2) U3.J8(VDD_CPU3) U3.J9(VDD_CPU4) U3.J10(VDD_CPU5) U3.J11(VDD_CPU6)
VCC-CPUFB: U3.L8(VDD_CPUFB) U7.40(DCDCA)
VCC-DRAM: C-FILTER-1.1 C-FILTER-3.1 C-FILTER-15.2 C-FILTER-16.2 C-POWER-16.2 L4.2 RRAM6.1 U3.L9(VCC_DRAM1) U3.L10(VCC_DRAM2) U3.L11(VCC_DRAM3) U3.L12(VCC_DRAM4) U3.L13(VCC_DRAM5) U4.A1(VDDQ#1) U4.A8(VDDQ#6) U4.B2(VDD#3) U4.C1(VDDQ#2) U4.C9(VDDQ#9) U4.D2(VDDQ#4) U4.D9(VDD#7) U4.E9(VDDQ#8) U4.F1(VDDQ#3) U4.G7(VDD#5) U4.H2(VDDQ#5) U4.H9(VDDQ#7) U4.K2(VDD#4) U4.K8(VDD#6) U4.N1(VDD#1) U4.N9(VDD#8) U4.R1(VDD#2) U4.R9(VDD#9) U5.A1(VDDQ#1) U5.A8(VDDQ#6) U5.B2(VDD#3) U5.C1(VDDQ#2) U5.C9(VDDQ#9) U5.D2(VDDQ#4) U5.D9(VDD#7) U5.E9(VDDQ#8) U5.F1(VDDQ#3) U5.G7(VDD#5) U5.H2(VDDQ#5) U5.H9(VDDQ#7) U5.K2(VDD#4) U5.K8(VDD#6) U5.N1(VDD#1) U5.N9(VDD#8) U5.R1(VDD#2) U5.R9(VDD#9) U7.9(DCDCD)
VCC-GPU: C-FILTER-8.2 C-FILTER-9.2 C-FILTER-10.1 C-FILTER-11.1 C-POWER-2.2 C-POWER-26.1 C-POWER-27.1 L3.2 U3.F9(VDD_GPU1) U3.F10(VDD_GPU2) U3.F11(VDD_SYS1) U3.F12(VDD_SYS2) U3.F13(VDD_SYS3) U3.G8(VDD_GPU3) U3.G9(VDD_GPU4) U3.G10(VDD_SYS4) U3.G11(VDD_SYS5) U3.G12(VDD_SYS6)
VCC-GPUFB: U3.F8(VDD_GPUFB) U7.47(DCDCC)
ALDO1: C-FILTER-6.1 C-FILTER-17.2 C-POWER-6.2 D44.2 R_HDMI_4.2 R_HDMI_5.2 U3.D10(VCC_IO) U3.E18(VCC_EPHY) U3.F5(VCC_PC) U7.28(ALDO1)
ALDO2: C-FILTER-7.1 C-POWER-7.1 U3.J6(VCC_PI) U3.M18(VCC_USB) U7.31(ALDO2) U7.32(ALDO3)
AP-RESET: C-RESET-2.2 H6.1 R-RESET-2.1 U7.15(PWROK)
AV: C-AVCC-6.2 L6.1 U3.J21(TV_OUT)
AVOUT: C-AVCC-5.2 H1.2 L6.2 R-AV-2.1
B1: IC1.40(PB0(XCK/T0)) U2.3
BLDO1: C-FILTER-2.1 C-FILTER-4.1 C-FILTER-5.1 C-FILTER-14.2 C-POWER-8.1 R-RESET-1.2 U3.D7(VCC_PG) U3.D11(VCC_DCXO) U3.D12(VCC_PLL) U3.F18(VCC_HDMI) U3.H20(VCC_TV) U3.L14(VDD18_DRAM) U7.2(BLDO1) U9.22(VDDIO)
BLDO2: C-POWER-9.1 U1.1 U2.1 U7.1(BLDO2)
CHANGE_INT: U3.E2(PC6/NAND_RB0?SDC2_CMD/BOOT_SEL4/PC_EINT6) U6.7(INT#)
COL1: IC1.9(PD0(RXD)) SW44.1(Row)
COL2: IC1.10(PD1(TXD)) SW45.1(Row)
COL3: IC1.14(PD5(OC1A)) SW46.1(Row)
COL4: IC1.15(PD6(ICP1)) SW47.1(Row)
COL5: IC1.16(PD7(OC2)) SW1.2(Col) SW11.2(Col) SW21.2(Col) SW31.2(Col)
COL6: IC1.19(PC0(SCL)) SW2.2(Col) SW12.2(Col) SW22.2(Col) SW32.2(Col)
COL7: IC1.20(PC1(SDA)) SW3.2(Col) SW13.2(Col) SW23.2(Col) SW33.2(Col)
COL8: IC1.21(PC2(TCK)) SW4.2(Col) SW14.2(Col) SW24.2(Col) SW34.2(Col)
COL9: IC1.22(PC3(TMS)) SW5.2(Col) SW15.2(Col) SW25.2(Col) SW35.2(Col)
COL10: IC1.23(PC4(TDO)) SW6.2(Col) SW16.2(Col) SW26.2(Col) SW36.2(Col)
COL11: IC1.24(PC5(TDI)) SW7.2(Col) SW17.2(Col) SW27.2(Col) SW37.2(Col)
COL12: IC1.25(PC6(TOSC1)) SW8.2(Col) SW18.2(Col) SW28.2(Col) SW38.2(Col)
COL13: IC1.26(PC7(TOSC2)) SW9.2(Col) SW19.2(Col) SW29.2(Col) SW39.2(Col)
COL14: IC1.36(PA1(ADC1)) SW10.2(Col) SW20.2(Col) SW30.2(Col)
COL15: IC1.37(PA0(ADC0)) SW41.2(Col) SW42.2(Col) SW43.2(Col)
COL16: IC1.41(PB1(T1)) SW40.2(Col)
D+: IC1.11(PD2(INT0)) R8.2
D-: IC1.12(PD3(INT1)) R9.2
DEDCE: C-POWER-15.2 C_SD_1.1 H4.1 L5.2 R_SD_2.1 R_SD_3.1 R_WIFI_6.1 TF1.4(VDD) U7.10(DCDCE) U9.9(VBAT) U10.7
EN-SCREEN: J1.1 U3.D3(PC5/NAND_RE/SDC2_CLK/BOOT_SEL3/PC_EINT5)
EN_CHARGE: U3.F4(PC7/NAND_RB1/SPI0_CS1/PC_EINT7) U6.9(CE#)
EXT_PORT_1: CN2.6 U3.B13(PH10/IR_RX/TCON_TRIG1/PH_EINT10)
EXT_PORT_2: CN5.1 U3.H5(Pl6/RGMIl_NULL/RMII_RXER/UART2_RX/TSO_ERR/TWIO_SDA/Pl_EINT6)
EXT_PORT_3: CN5.2 U3.K6(PI16/EPHY_25M/UART4_CTS/TS0_D7/CLK_FANOUT1/PI_EINT16)
GPO: H7.2 U7.14(GPO)
H1: CN3.1(TMDSData2+) D45.1(I/O1) D45.10(NC) U3.C19(HTX2P)
H2: CN3.3(TMDSData2-) D45.2(I/O2) D45.9(NC) U3.C20(HTX2N)
H3: CN3.4(TMDSData1+) D45.4(I/O3) D45.7(NC) U3.D20(HTX1P)
H4: CN3.6(TMDSData1-) D45.5(I/O4) D45.6(NC) U3.D21(HTX1N)
H5: CN3.7(TMDSData0+) D46.1(I/O1) D46.10(NC) U3.E19(HTX0P)
H6: CN3.9(TMDSData0-) D46.2(I/O2) D46.9(NC) U3.E20(HTX0N)
H7: CN3.10(TMDSClock+) D46.4(I/O3) D46.7(NC) U3.F20(HTXCP)
H8: CN3.12(TMDSClock-) D46.5(I/O4) D46.6(NC) U3.F21(HTXCN)
MISO: IC1.2(PB6(MISO)) J3.5
MOSI: IC1.1(PB5(MOSI)) J3.2
PMU-SCK: U3.C18(PLO/RSB_SCK/S_TWIO_SCK) U6.5(SCL) U7.23(SCK)
PMU-SDA: U3.B18(PL1/RSB_SDA/S_TWIO_SDA) U6.6(SDA) U7.24(SDA)
PRX: IC1.30(PA7(ADC7)) U2.2
PRY: IC1.31(PA6(ADC6)) U1.2
RESET: C-RESET-1.2 R-RESET-1.1 R-RESET-2.2 U3.A16(RESET)
RGEN: C-POWER-21.1 R-POWER-3.1 R-POWER-4.2 U6.22(REGN)
ROW1: D1.2(K) D2.2(K) D3.2(K) D4.2(K) D5.2(K) D6.2(K) D7.2(K) D8.2(K) D9.2(K) D10.2(K) D40.2(K) D43.2(K) IC1.35(PA2(ADC2))
ROW2: D11.2(K) D12.2(K) D13.2(K) D14.2(K) D15.2(K) D16.2(K) D17.2(K) D18.2(K) D19.2(K) D20.2(K) D41.2(K) IC1.34(PA3(ADC3))
ROW3: D21.2(K) D22.2(K) D23.2(K) D24.2(K) D25.2(K) D26.2(K) D27.2(K) D28.2(K) D29.2(K) D30.2(K) D42.2(K) IC1.33(PA4(ADC4))
ROW4: D31.2(K) D32.2(K) D33.2(K) D34.2(K) D35.2(K) D36.2(K) D37.2(K) D38.2(K) D39.2(K) IC1.32(PA5(ADC5))
RST: IC1.4(RESET#) J3.3 KEY2.3 KEY2.4 R3.1
SA0: U3.P18(SACT) U4.N3(A0) U5.N3(A0)
SA1: U3.R15(SBA1) U4.P7(A1) U5.P7(A1)
SA2: U3.T18(SA2) U4.P3(A2) U5.P3(A2)
SA3: U3.R19(SA10) U4.N2(A3) U5.N2(A3)
SA4: U3.U16(SA12) U4.P8(A4) U5.P8(A4)
SA5: U3.R20(SCS1) U4.P2(A5) U5.P2(A5)
SA6: U3.N13(SA15) U4.R8(A6) U5.R8(A6)
SA7: U3.T21(SA0) U4.R2(A7) U5.R2(A7)
SA8: U3.V17(SCS0) U4.T8(A8) U5.T8(A8)
SA9: U3.T20(SODT0) U4.R3(A9) U5.R3(A9)
SA10: U3.U19(SA8) U4.L7(A10) U5.L7(A10)
SA11: U3.U17(SA1) U4.R7(A11) U5.R7(A11)
SA12: U3.P16(SA13) U4.N7(A12) U5.N7(A12)
SA13: U3.R18(SA4) U4.T3(A13) U5.T3(A13)
SA14: U3.P15(SA5) U4.T7(A14) U5.T7(A14)
SA15: U3.U18(SA16) U4.M7(A15) U5.M7(A15)
SBA0: U3.P20(SBG0) U4.M2(BA0) U5.M2(BA0)
SBA1: U3.U15(SA11) U4.N8(BA1) U5.N8(BA1)
SBA2: U3.U20(SA6) U4.M3(BA2) U5.M3(BA2)
SCAS: U3.N16(SA9) U4.K3(CAS#) U5.K3(CAS#)
SCK: IC1.3(PB7(SCK)) J3.4 JP2.2 U3.H1(PC14/NAND_DQ2/SDC2_D6/PC_EINT14)
SCKE0: U3.V15(SCKE0) U4.K9(CKE) U5.K9(CKE)
SCKE1: U3.P13(SCKE1) U4.J9(CKE1) U5.J9(CKE1)
SCKN: RRAM8.2 U3.U14(SCKN) U4.K7(CK#) U5.K7(CK#)
SCKP: RRAM8.1 U3.T14(SCKP) U4.J7(CK) U5.J7(CK)
SCS0: U3.P21(SBG1) U4.L2(CS#) U5.L2(CS#)
SCS1: U3.N19(SA7) U4.L1(CS1#) U5.L1(CS1#)
SDA: JP2.1 U3.H2(PC15/NAND_DQ1/SDC2_D2/SPI0_WP/PC_EINT15)
SDQ0: U3.N3(SDQ0) U4.H3(DQL4)
SDQ1: U3.U4(SDQ1) U4.F7(DQL1)
SDQ2: U3.N2(SDQ2) U4.G2(DQL6)
SDQ3: U3.T4(SDQ3) U4.F8(DQL3)
SDQ4: U3.U3(SDQ4) U4.H8(DQL5)
SDQ5: U3.P1(SDQ5) U4.E3(DQL0)
SDQ6: U3.T2(SDQ6) U4.H7(DQL7)
SDQ7: U3.P2(SDQ7) U4.F2(DQL2)
SDQ8: U3.P5(SDQ8) U4.A7(DQU4)
SDQ9: U3.V3(SDQ9) U4.D7(DQU0)
SDQ10: U3.P4(SDQ10) U4.C3(DQU1)
SDQ11: U3.R4(SDQ11) U4.C2(DQU3)
SDQ12: U3.R6(SDQ12) U4.C8(DQU2)
SDQ13: U3.N4(SDQ13) U4.A3(DQU7)
SDQ14: U3.P6(SDQ14) U4.B8(DQU6)
SDQ15: U3.N5(SDQ15) U4.A2(DQU5)
SDQ16: U3.T11(SDQ16) U5.F8(DQL3)
SDQ17: U3.U12(SDQ17) U5.H7(DQL7)
SDQ18: U3.T12(SDQ18) U5.H8(DQL5)
SDQ19: U3.U9(SDQ19) U5.F7(DQL1)
SDQ20: U3.T6(SDQ20) U5.F2(DQL2)
SDQ21: U3.U5(SDQ21) U5.H3(DQL4)
SDQ22: U3.T7(SDQ22) U5.G2(DQL6)
SDQ23: U3.T5(SDQ23) U5.E3(DQL0)
SDQ24: U3.R9(SDQ24) U5.A2(DQU5)
SDQ25: U3.P7(SDQ25) U5.D7(DQU0)
SDQ26: U3.N7(SDQ26) U5.C3(DQU1)
SDQ27: U3.P9(SDQ27) U5.A3(DQU7)
SDQ28: U3.P10(SDQ28) U5.C2(DQU3)
SDQ29: U3.U11(SDQ29) U5.B8(DQU6)
SDQ30: U3.P12(SDQ30) U5.A7(DQU4)
SDQ31: U3.R12(SDQ31) U5.C8(DQU2)
SDQM0: U3.U1(SDQM0) U4.E7(DML)
SDQM1: U3.R3(SDQM1) U4.D3(DMU)
SDQM2: U3.T9(SDQM2) U5.E7(DML)
SDQM3: U3.N10(SDQM3) U5.D3(DMU)
SDQS0N: U3.R1(SDQS0N) U4.G3(DQSL#)
SDQS0P: U3.R2(SDQS0P) U4.F3(DQSL)
SDQS1N: U3.V2(SDQS1N) U4.B7(DQSU#)
SDQS1P: U3.U2(SDQS1P) U4.C7(DQSU)
SDQS2N: U3.U8(SDQS2N) U5.G3(DQSL#)
SDQS2P: U3.V8(SDQS2P) U5.F3(DQSL)
SDQS3N: U3.U10(SDQS3N) U5.B7(DQSU#)
SDQS3P: U3.V10(SDQS3P) U5.C7(DQSU)
SODT0: U3.N20(SODT1) U4.K1(ODT) U5.K1(ODT)
SODT1: U3.N21(SBA0) U4.J1(ODT1) U5.J1(ODT1)
SOUNDL: C-SOUND-1.2 R_SOUND_1.1 U3.G19(ALNEOUTL)
SOUNDR: C-SOUND-2.2 R_SOUND_2.1 U3.G20(ALNEOUTR)
SRAS: U3.T16(SA3) U4.J3(RAS#) U5.J3(RAS#)
SRST: U3.U21(SRST) U4.T2(RESET) U5.T2(RESET)
SVREF: C-FILTER-22.1 C-FILTER-23.1 RRAM6.2 RRAM7.1 U4.H1(VREFCQ) U4.M8(VREFCA) U5.H1(VREFCQ) U5.M8(VREFCA)
SWE: U3.V20(SA14) U4.L3(WE) U5.L3(WE)
USB_4G_MODULE_DM: U3.L19(USB3_DM) U11.2
USB_4G_MODULE_DP: U3.L20(USB3_DP) U11.3
USB_KEYBOARD_D+: R8.1 U3.M20(USB1_DP)
USB_KEYBOARD_D-: R9.1 U3.M19(USB1_DM)
USB_MAIN_D+: U3.J20(USB0_DP) USB1.A6(DP1) USB1.B6(DP2)
USB_MAIN_D-: U3.J19(USB0_DM) USB1.A7(DN1) USB1.B7(DN2)
VCHARGE: C-POWER-23.2 U6.1(VBUS) U6.24(VAC) USB1.A4B9(VBUS) USB1.B4A9(VBUS)
$1N35: H2.1 U3.D16(PH0/UART0_TX/CAN_TX/PWM3/TWI1_SCK/PH_EINT0)
$1N36: H2.2 U3.D15(PH1/UART0_RX/CAN_RX/PWM4/TWI1_SDA/PH_EINT1)
$1N52: R_WIFI_1.2 U3.A6(PF1/SDPG0/SDC1_CLK/PG0/SDC1_CLK/PG_EINT0/JTAG_DI/PF_EINT1)
$1N53: U3.C7(PG1/SDC1_CMD/PG_EINT1) U9.16(SDIO_DATA_CMD)
$1N54: U3.C6(PG2/SDC1_D0/PG_EINT2) U9.18(SDIO_DATA_0)
$1N55: U3.B5(PG3/SDC1_D1/PG_EINT3) U9.19(SDIO_DATA_1)
$1N56: U3.C5(PG4/SDC1_D2/PG_EINT4) U9.14(SDIO_DATA_2)
$1N57: U3.B7(PG4/SPG5/SDC1_D3/PG5/SDC1_D3/PG_EINT5/PG_EINT4) U9.15(SDIO_DATA_3)
$1N58: R_WIFI_2.2 U3.A2(PG18/UART2_CTS/MCSI_SDA/TWI3_SDA/PG_EINT18) U9.12(WL_REG_ON)
$1N59: U3.A8(PG15/UART2_TX/TWI4_SCK/PG15/UART2_TX/TWI4_SCK/PG_EINT15) U9.13(WL_HOST_WAKE)
$1N60: R_WIFI_4.2 U3.C3(PG17/USART_RTS/MCSI_SCK/TWI3_SCK/PG_EINT17) U9.6(BT_WAKE)
$1N61: U3.B8(PG16/UART2_RX/TW14_SCK/PG_EINT15) U9.7(BT_HOST_WAKE)
$1N86: R_WIFI_3.2 U9.34(BT_RST_N)
$1N87: R_WIFI_3.1 U3.B2(PG19/MCSI_MCLK/PWM1/PG_EINT19)
$1N153: C_WIFI_2.2 R_WIFI_5.2 U9.2(WL-BT-ANT)
$1N166: U3.A4(PG6/UART1_TX/JTAG_MS/PG_EINT6) U9.43(UART_RXD)
$1N167: U3.B4(PG7/UART1_RX/JTAG_CK/PG_EINT7) U9.42(UART_TXD)
$1N168: U3.C4(PG9/UART1_RTS/PLL_LOCK_DEB/JTAG_D0/PG_EINT8PG7/UART1_RX/JTAG_CK/PG_EINT7) U9.44(UART_CTS_N)
$1N169: U3.B3(PG9/UART1_CTS/JTAG_DI/AC_ADCY/PG_EINT9) U9.41(UART_RTS_N)
$1N176: C_WIFI_3.1 U9.23(VIN_LDO)
$1N181: R_WIFI_6.2 U3.C8(PG10/H_I2S2_MCLK/X32KFOUT/AC_MCLK/PG_EINT10PG9/UART1_CTS/JTAG_DI/AC_ADCY/PG_EINT9) U9.24(LPO)
$1N184: U3.B9(PG14/H_I2S2_DIN0/HH_I2S2_DOUT1/BIST_RESULT3/AC_ADCX/PG_EINT14) U9.25(PCM_OUT)
$1N185: U3.B10(PG11/H_I2S2_BCLK/BIST_RESULT0/AC_SYNC/PG_EINT11) U9.26(PCM_CLK)
$1N186: U3.C10(PG13/H_I2S2_DOUT0/H_I2S2_DIN1/BIST_RESULT2/AC_ADCR/PG_EINT13) U9.27(PCM_IN)
$1N187: U3.C9(PG12/H_I2S2_LRCK/BIST_RESULT1/AC_ADCL/PG_EINT12) U9.28(PCM_SYNC)
$1N200: TF1.1(DAT2) U3.L3(PF5/SDC0_D2/JTAG_CK/PF_EINT5)
$1N201: TF1.2(CD/DAT3) U3.L2(PF4/SDC0_D3/UART0_RX/PF_EINT4)
$1N202: TF1.8(DAT1) U3.J2(PF0/SDC0_D1/JTAG_MS/PF_EINT0)
$1N203: TF1.7(DAT0) U3.J3(PF1/SDC0_D0/JTAG_DI/PF_EINT1)
$1N204: TF1.5(CLK) U3.K1(PF2/SDC0_CLK/UART0_TX/PF_EINT2)
$1N205: R_SD_2.2 TF1.3(CMD) U3.K3(PF3/SDC0_CMD/JTAG_DO/PF_EINT3)
$1N216: R_SD_1.2 U3.K2(PF6/PF_EINT6)
$1N217: R_SD_1.1 R_SD_3.2 TF1.9(CD)
$1N294: LED2.1 U3.G3(PC13/NAND_DQ3/SDC2_D1/PC_EINT13)
$1N295: LED1.1 U3.G2(PC12/NAND_DQS/PC_EINT12)
$1N348: JP1.8 U3.B1(PC0/NAND_WE/SDC2_DS/SPI0_CLK/PC_EINT0)
$1N349: JP1.7 U3.C1(PC2/NAND_CLE/SPI0_MOSI/PC_EINT2)
$1N350: JP1.6 U3.D1(PC3/NAND_CE1/SPI0_CS0/BOOT_SEL1/PC_EINT3)
$1N351: JP1.5 U3.D2(PC4/NAND_CE0/SPI0_MISO/BOOT_SEL2/PC_EINT4)
$1N352: JP2.4 U3.E3(PC8/NAND_DQ7/SDC2_D3/PC_EINT8)
$1N353: JP2.3 U3.F1(PC9/NAND_DQ6/SDC2_D4/PC_EINT9)
$1N354: JP2.6 U3.F2(PC10/NAND_DQ5/SDC2_D0/PC_EINT10)
$1N355: JP2.7 U3.F3(PC11/NAND_DQ4/SDC2_D5/PC_EINT11)
$1N356: JP1.4 U3.C15(PH3/UART5_RX/SPDIF_IN/PWM1/TWI2_SDA/PH_EINT3/EPHY-LINK-LED)
$1N357: JP1.3 U3.B15(PH2/UART5_TX/SPDIF_CLK/PWM2/TWI2_SCK/PH_EINT2/EPHY-SPD-LED)
$1N380: CN1.1 U3.A14(PH4/SPDIF_OUT/TWI3_SCK/PH_EINT4)
$1N381: CN1.2 U3.B14(PH5/UART2_TX/H_I2S3_MCLK/SPI1_CS0/TWi3_SDA/PH_EINT5)
$1N392: CN2.1 U3.C14(PH6/UART2_RX/H_I2S3_BCLK/SPI1_CLK/TWI4_SCK/PH_EINT6)
$1N393: CN2.2 U3.B12(PH7/UART2_RTS/H_I2S3_LRCK/SPI1_MOSI/TWI4_SDA/PH_EINT7)
$1N394: CN2.3 U3.C13(PH8/UART2_CTS/H_I2S3_DOUT0/SPI1_MISO/H_I2S3_DIN1/PH_EINT8)
$1N395: CN2.4 U3.A12(PH9/H_I2S3_DIN0/SPI1_CS1/H_I2S3_DOUT1/PH_EINT9)
$1N413: U3.L4(PI15/MDIO/UART4_RTS/TSO_D6/CLK_FANOUTO/PI_EINT15) U10.16
$1N414: U3.L6(Pl14/MDC/UART4_RX/TS0_D5/PWM4/PI_EINT14) U10.15
$1N415: U3.E5(PI13/RGMIl_CLKIN/RMIl_NULL/UART4_TX/TSO_D4/PWM3/Pl_EINT13) U10.14
$1N416: U3.K5(PI12/RGMII_TXCTL/RMII_TXEN/UART3_CTS/TSO_D3/PWM2/PI_EINT12) U10.13
$1N417: U3.K4(PI11/RGMII_TXCK/RMII_TXCK/UART3_RTS/TSO_D2/PWM1/PI_EINT11) U10.12
$1N418: U3.L5(PI10/RGMII_TXDO/RMIl_TXDO/UART3_RX/TSO_D1/TWI2_SDA/PI_EINT10) U10.11
$1N419: U3.D5(PI9/RGMII_TXD1/RMIIl_TXD1/UART3_TX/TSO_DO/TWI2_SCK/PIL_EINT9) U10.10
$1N420: U3.E6(PI8/RGMIL_TXD2/RMII_NULL/UART2_CTS/TSO_DVLD/TWI1_SDA/PI_EINT8) U10.9
$1N421: U3.G4(PI7/RGMII_TXD3/RMIl_NULL/UART2_RTS/TSO_SYNC/TWI1_SCK/PI_EINT7) U10.8
$1N422: U3.H4(PI5/RGMII_RXCTL/RMII_CRS_DV/UART2_TX/TSO_CLK/TWIO_SCK/PIL_EINT5) U10.6
$1N423: U3.G5(Pl4/RGMII_RXCK/RMII_NULL/DMIC_DATA3/H_l2SO_DINO/H_I2So_DouT1/Pl_EINT4) U10.5
$1N424: U3.E4(PI3/RGMII_RXDO/RMII_RXDO/DMIC_DATA2/H_J25O_DOUTO/H_2SO_DIN1/Pl_EINT3) U10.4
$1N425: U3.G6(I1/RGMII_RXD2/RMII_NULL/DMIC_DATA0/H_I2S0_BCLK/HDMI_SDA/PI_EINT1) U10.3
$1N426: U3.D4(PI1/RGMII_RXD2/RMII_NULL/DMIC_DATA0/H_I2S0_BCLK/HDMI_SDA/PI_EINT1) U10.2
$1N427: U3.H6(PI0/RGMII_RXD3/RMII_NULL/DMIC_CLK/H_I2S0_MCLK/HDMI_SCL/PI_EINT0) U10.1
$1N434: JP2.5 U3.H3(PC16/NAND_DQ0/SDC2_D7/SPI0_HOLD/PC_EINT16)
$1N478: JP1.1 U3.C2(PC1/NAND_ALE/SDC2_RST/PC_EINT1)
$1N544: R_WIFI_1.1 U9.17(SDIO_DATA_CLK)
$1N545: LED1.2 R_LED_2.1
$1N546: LED2.2 R_LED_1.1
$3N159: L1.1 U7.43(LXA_2) U7.44(LXA_1)
$3N160: L3.1 U7.50(LXC_2) U7.51(LXC_1)
$3N161: L4.1 U7.7(LXD)
$3N162: L5.1 U7.12(LXE)
$3N441: U7.35(LXB_1) U7.36(LXB_2)
$3N467: R-POWER-1.2 R-POWER-2.2 U7.26(PHSET)
$3N468: R-POWER-2.1 U7.25(VINT) U7.55(MODESET)
$3N484: C-POWER-18.2 U7.29(VREF)
$3N499: U7.16(IRQ) X2.P$1
$3N599: C-POWER-19.2 U6.23(PMID)
$3N603: C-POWER-20.1 L2.1 U6.19(SW) U6.20(SW)
$3N616: C-POWER-20.2 U6.21(BTST)
$3N648: R_LED_4.2 U6.3(D-)
$3N649: R_LED_3.2 U6.4(STAT)
$3N703: R-POWER-3.2 U6.11(TS)
$3N745: R-POWER-5.2 USB1.B5(CC2)
$3N756: R-POWER-6.2 USB1.A5(CC1)
$3N966: R-POWER-7.1 R-POWER-8.1 U7.27(EN/PWRON)
$3N1006: H1.1 U8.3(VOUT+)
$3N1013: LED4.2 R_LED_3.1
$3N1014: LED3.2 R_LED_4.1
$4N136: RRAM1.2 U4.L8(ZQ)
$4N137: RRAM2.2 U4.L9(ZQ1)
$4N162: RRAM4.2 U5.L8(ZQ)
$4N163: RRAM3.2 U5.L9(ZQ1)
$4N312: RRAM5.2 U3.L15(SZQ)
$5N103: H4.2 U3.K19(USB2_DM)
$5N104: H4.3 U3.K20(USB2_DP)
$5N125: C-PLL-2.1 U3.B11(DXIN) X3.1(OSC1)
$5N136: C-PLL-1.2 U3.C12(DXOUT) X3.3(OSC2)
$5N216: C-PLL-3.1 U3.D13(DXLDO_OUT)
$5N247: H5.1 U3.B17(FEL)
$5N316: C-AVCC-1.2 U3.D18(AC_AVCC)
$5N327: C-AVCC-2.2 U3.C17(AC_VRA1)
$5N354: CN3.19(HotPlugDetect) R_HDMI_1.1
$5N401: R_HDMI_3.2 U3.G21(HSDA)
$5N402: R_HDMI_2.2 U3.F19(HSCL)
$5N403: CN3.16(SDA) R_HDMI_3.1 R_HDMI_5.1
$5N404: CN3.15(SCL) R_HDMI_2.1 R_HDMI_4.1
$5N417: R_HDMI_6.2 U3.G17(HCEC)
$5N418: CN3.13(CEC) R_HDMI_6.1 R_HDMI_7.1
$5N419: R_HDMI_1.2 U3.G18(HHPD)
$5N451: D44.1 R_HDMI_7.2
$5N521: C-AVCC-3.2 U3.J18(VRA1)
$5N522: C-AVCC-4.2 U3.J17(VRA2)
$5N534: R-AV-1.2 U3.K18(REXT)
$5N555: C-FILTER-20.1 C-FILTER-21.2 U3.H17(AVCC)
$5N658: C-SOUND-4.2 R_SOUND_2.2
$5N659: C-SOUND-3.2 R_SOUND_1.2
Net-(ANT1-3): ANT1.3(SHIELD2) C_WIFI_1.1 R_WIFI_5.1
Net-(C-SOUND-1-1): C-SOUND-1.1 CN4.3 H8.3
Net-(C-SOUND-2-1): C-SOUND-2.1 CN4.2 H8.2
Net-(D1-1): D1.1(A) SW1.1(Row)
Net-(D2-1): D2.1(A) SW2.1(Row)
Net-(D3-1): D3.1(A) SW3.1(Row)
Net-(D4-1): D4.1(A) SW4.1(Row)
Net-(D5-1): D5.1(A) SW5.1(Row)
Net-(D6-1): D6.1(A) SW6.1(Row)
Net-(D7-1): D7.1(A) SW7.1(Row)
Net-(D8-1): D8.1(A) SW8.1(Row)
Net-(D9-1): D9.1(A) SW9.1(Row)
Net-(D10-1): D10.1(A) SW10.1(Row)
Net-(D11-1): D11.1(A) SW11.1(Row)
Net-(D12-1): D12.1(A) SW12.1(Row)
Net-(D13-1): D13.1(A) SW13.1(Row)
Net-(D14-1): D14.1(A) SW14.1(Row)
Net-(D15-1): D15.1(A) SW15.1(Row)
Net-(D16-1): D16.1(A) SW16.1(Row)
Net-(D17-1): D17.1(A) SW17.1(Row)
Net-(D18-1): D18.1(A) SW18.1(Row)
Net-(D19-1): D19.1(A) SW19.1(Row)
Net-(D20-1): D20.1(A) SW20.1(Row)
Net-(D21-1): D21.1(A) SW21.1(Row)
Net-(D22-1): D22.1(A) SW22.1(Row)
Net-(D23-1): D23.1(A) SW23.1(Row)
Net-(D24-1): D24.1(A) SW24.1(Row)
Net-(D25-1): D25.1(A) SW25.1(Row)
Net-(D26-1): D26.1(A) SW26.1(Row)
Net-(D27-1): D27.1(A) SW27.1(Row)
Net-(D28-1): D28.1(A) SW28.1(Row)
Net-(D29-1): D29.1(A) SW29.1(Row)
Net-(D30-1): D30.1(A) SW30.1(Row)
Net-(D31-1): D31.1(A) SW31.1(Row)
Net-(D32-1): D32.1(A) SW32.1(Row)
Net-(D33-1): D33.1(A) SW33.1(Row)
Net-(D34-1): D34.1(A) SW34.1(Row)
Net-(D35-1): D35.1(A) SW35.1(Row)
Net-(D36-1): D36.1(A) SW36.1(Row)
Net-(D37-1): D37.1(A) SW37.1(Row)
Net-(D38-1): D38.1(A) SW38.1(Row)
Net-(D39-1): D39.1(A) SW39.1(Row)
Net-(D40-1): D40.1(A) SW41.1(Row)
Net-(D41-1): D41.1(A) SW42.1(Row)
Net-(D42-1): D42.1(A) SW43.1(Row)
Net-(D43-1): D43.1(A) SW40.1(Row)
Net-(IC1-7): IC1.7(XTAL2) X1.3
Net-(IC1-8): IC1.8(XTAL1) X1.1
Net-(IC1-13): IC1.13(PD4(OC1B)) KEY1.3 KEY1.4

Not connected (* = marked no-connect by the designer): CN3 14(Reserved(N.C.))* 18(+5VPower)*; IC1 29(AREF)* 42(PB2(AIN0/INT2))* 43(PB3(AIN1/OC0))* 44(PB4(SS#))*; U3 A19(EPHY_TXP)* A20(EPHY_TXN)* B19(EPHY_RTX)* B20(EPHY_RXP)* B21(EPHY_RXN)* C11(REFCLK_OUT)* C16(JTAG_SEL)* D14(PLLTEST)* L18(LRADC)*; U6 8(NC)* 10(NC)* 12(QON#)*; U7 4(BLDO3)* 5(BLDO4)* 17(CLDO3)* 20(CLDO2)* 21(SWIN)* 22(SWOUT)* 39(DCDCB)* 56(DCBSET)*; U9 4(FM_RX)* 5(N_WAKE)* 8(BT_VIO/N_HOST_WAKE)* 10(XTAL_IN)* 11(XTAL_OUT)* 21(VIN_LDO_OUT)* 29(VDD_TCXO)* 30(TCXO_IN)* 32(GPS_RF)* 35(N_I2C_SDA)* 37(N_I2C_SCL)* 38(N_REG_PU)* 39(TX2)* 40(TX1)*; U10 17; U11 1* 4* 7; USB1 A8(SBU1)* B8(SBU2)*

## Notes on the sheets
sheet 1
- 蓝牙音频PCM总线
- https://oshwhub.com/CQT-LINFENG/a20-hu-xin-ban
- https://mbb.eet-china.com/download/249192.html（附件里有压缩包，不用再去注册）
sheet 2
- RESET
- BOOT
- https://www.eefocus.com/circuit/1176388.html
- 注：
- 带RGB的最简可编程直列键盘：https://oshwhub.com/iqirtryi/pbk40-rgb-keyboard-c
- 优联无线主控40键直列键盘：https://oshwhub.com/iqirtryi/K230-PKB40
- ATmega32A作主控：https://oshwhub.com/iqirtryi/kb40-atmega32a
- 热门小配列键盘详见：https://oshwhub.com/iqirtryi  QQ交流群：741456206。
sheet 3
- https://edu.21ic.com/video/2060
- https://e2e.ti.com/support/power-management-group/power-management/f/power-management-forum/890373/bq25601-schematic-review?ReplyFilter=Answers&ReplySortBy=Answers&ReplySortOrder=Descending
- https://mangoh.io/uploaded-documents/Reference/mangOH%20Yellow/Hardware/Schematics/mangoh_yellow_21.pdf
- STAT位变为高电平，PG引脚变为低电平，表示输入源良好。
- 畅享10E荣耀9A 红米note9使用的设计
- STAT功能 正在充电：低
  充电完成或充电器处于睡眠模式：高
  充电暂停（故障响应）：1-Hz，50%占空比脉冲
- C-FILTER-19
- 工作在MASTER模式
- 0.6V- 1.52V
- 默认焊R_power1和7
sheet 4
- 严格等长，700mil
- 原文件顶层线路阻抗线线宽0.157mm，线距0.088mm，补偿后线距0.058mm，超我司最小0.066mm线距要求。底层线路线宽0.147mm.BGA到线间距0.089mm，补偿后BGA到线间距0.059mm，且多处线距补偿后0.058mm，不足0.066mm。
- https://www.mr-wu.cn/ddr-layout-rules-processes/
- DDR的PCB单端走线阻抗一般控制为50欧，差分走线阻抗一般控制为100欧
- 层数6、板厚1.6mm、内层、差分阻抗、线距4mil、JLC2313
- https://www.bilibili.com/read/cv9376978
- https://licheeone.readthedocs.io/zh/latest/%E7%A1%AC%E4%BB%B6/1.2.2%20DDR%E9%83%A8%E5%88%86Layout.html
sheet 5
- HDMI没有输出供电
- (模拟)连接U1的H19脚，单点接地
